# Altium project RK3588底板.PrjPcb (part 1 of 5)
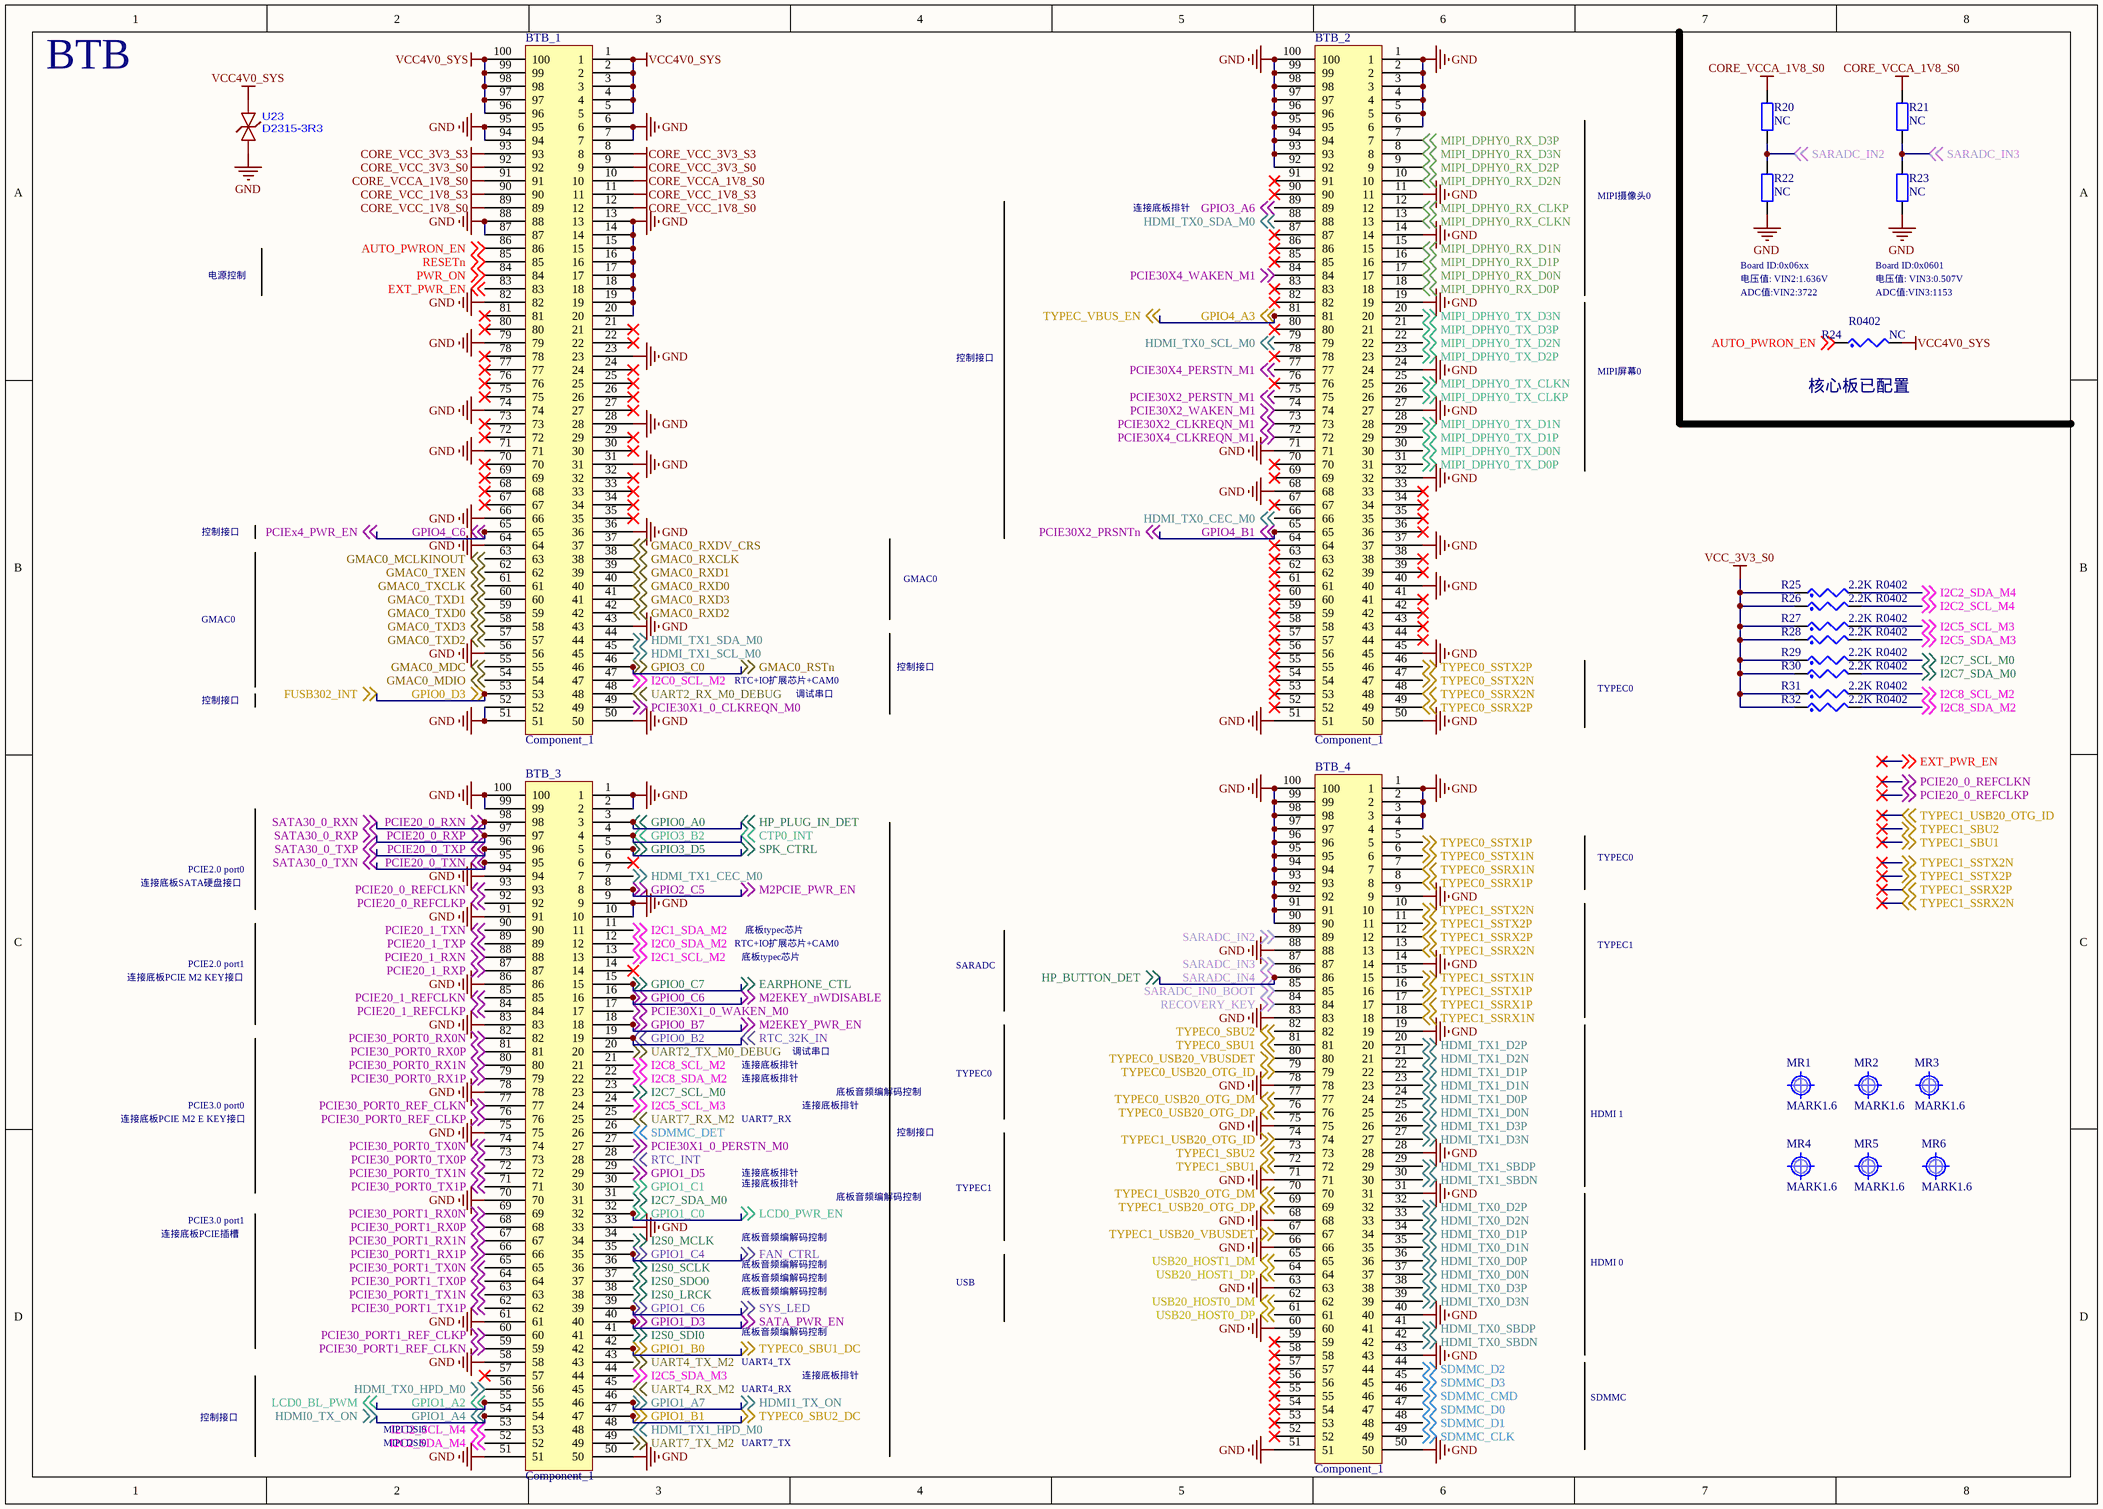
[diagram p0: 1.BTB.SchDoc]
13 sheets, 715 parts. Net scope: global (net labels, ports and power ports of the same name join across sheets).
Board file: 0.PCB1.PcbDoc
Sheets:
  1.BTB.SchDoc
  2.电源.SchDoc
  3.DEBUG_SD卡_RTC_按键.SchDoc
  4.以太网_eth1.SchDoc
  5.USB3.SchDoc
  6.音频_FAN_ADC_LED.SchDoc
  7.HDMI2.SchDoc
  8.HDMI2.SchDoc
  9.PCIE3.SchDoc
  10.PCIE2.SchDoc
  11.MIPI DSI_CSI.SchDoc
  12.SATA接口.SchDoc
  13.GPIO扩展接口.SchDoc

## Sheet 1.BTB.SchDoc
size A3; SheetNumber: 1; SheetTotal: 13

### Parts
BTB_1  Component_1  [F_100PIN]
BTB_2  Component_1  [F_100PIN]
BTB_3  Component_1  [F_100PIN]
BTB_4  Component_1  [F_100PIN]
MR1  MARK1.6  [Mark 1]
MR2  MARK1.6  [Mark 1]
MR3  MARK1.6  [Mark 1]
MR4  MARK1.6  [Mark 1]
MR5  MARK1.6  [Mark 1]
MR6  MARK1.6  [Mark 1]
R20  NC  [R0402_L]
R21  NC  [R0402_L]
R22  NC  [R0402_L]
R23  NC  [R0402_L]
R24  NC  [R0402]
R25  2.2K  [R0402]
R26  2.2K  [R0402]
R27  2.2K  [R0402]
R28  2.2K  [R0402]
R29  2.2K  [R0402]
R30  2.2K  [R0402]
R31  2.2K  [R0402]
R32  2.2K  [R0402]
U23  D2315-3R3  [DFN1006-2L-BI]

### Nets
CORE_VCC_1V8_S0: BTB_1.12 BTB_1.89
CORE_VCC_1V8_S3: BTB_1.11 BTB_1.90
CORE_VCC_3V3_S0: BTB_1.9 BTB_1.92
CORE_VCC_3V3_S3: BTB_1.8 BTB_1.93
CORE_VCCA_1V8_S0: BTB_1.10 BTB_1.91 R20.2 R21.2
GND: BTB_1.6 BTB_1.7 BTB_1.13 BTB_1.14 BTB_1.15 BTB_1.16 BTB_1.17 BTB_1.18 BTB_1.19 BTB_1.20 BTB_1.23 BTB_1.28 BTB_1.31 BTB_1.36 BTB_1.43 BTB_1.50 BTB_1.51 BTB_1.52 BTB_1.56 BTB_1.64 BTB_1.66 BTB_1.71 BTB_1.74 BTB_1.79 BTB_1.82 BTB_1.87 BTB_1.88 BTB_1.94 BTB_1.95 BTB_2.1 BTB_2.2 BTB_2.3 BTB_2.4 BTB_2.5 BTB_2.6 BTB_2.11 BTB_2.14 BTB_2.19 BTB_2.24 BTB_2.27 BTB_2.32 BTB_2.37 BTB_2.40 BTB_2.45 BTB_2.50 BTB_2.51 BTB_2.68 BTB_2.71 BTB_2.92 BTB_2.93 BTB_2.94 BTB_2.95 BTB_2.96 BTB_2.97 BTB_2.98 BTB_2.99 BTB_2.100 BTB_3.1 BTB_3.2 BTB_3.9 BTB_3.10 BTB_3.33 BTB_3.50 BTB_3.51 BTB_3.58 BTB_3.61 BTB_3.70 BTB_3.75 BTB_3.78 BTB_3.83 BTB_3.86 BTB_3.91 BTB_3.94 BTB_3.99 BTB_3.100 BTB_4.1 BTB_4.2 BTB_4.3 BTB_4.4 BTB_4.9 BTB_4.14 BTB_4.19 BTB_4.28 BTB_4.31 BTB_4.40 BTB_4.43 BTB_4.50 BTB_4.51 BTB_4.60 BTB_4.63 BTB_4.66 BTB_4.68 BTB_4.71 BTB_4.75 BTB_4.78 BTB_4.83 BTB_4.88 BTB_4.90 BTB_4.91 BTB_4.92 BTB_4.93 BTB_4.94 BTB_4.95 BTB_4.96 BTB_4.97 BTB_4.98 BTB_4.99 BTB_4.100 R22.1 R23.1 U23.1
VCC4V0_SYS: BTB_1.1 BTB_1.2 BTB_1.3 BTB_1.4 BTB_1.5 BTB_1.96 BTB_1.97 BTB_1.98 BTB_1.99 BTB_1.100 R24.2 U23.2
VCC_3V3_S0: R25.1 R26.1 R27.1 R28.1 R29.1 R30.1 R31.1 R32.1
AUTO_PWRON_EN: BTB_1.86 R24.1 ; off-sheet AUTO_PWRON_EN
CTP0_INT: BTB_3.4 ; off-sheet GPIO3_B2, off-sheet CTP0_INT  [also labelled GPIO3_B2]
EARPHONE_CTL: BTB_3.15 ; off-sheet GPIO0_C7, off-sheet EARPHONE_CTL  [also labelled GPIO0_C7]
EXT_PWR_EN: BTB_1.83 ; off-sheet EXT_PWR_EN
FAN_CTRL: BTB_3.35 ; off-sheet GPIO1_C4, off-sheet FAN_CTRL  [also labelled GPIO1_C4]
FUSB302_INT: BTB_1.53 ; off-sheet GPIO0_D3, off-sheet FUSB302_INT  [also labelled GPIO0_D3]
GMAC0_MCLKINOUT: BTB_1.63 ; off-sheet GMAC0_MCLKINOUT
GMAC0_MDC: BTB_1.55 ; off-sheet GMAC0_MDC
GMAC0_MDIO: BTB_1.54 ; off-sheet GMAC0_MDIO
GMAC0_RSTn: BTB_1.46 ; off-sheet GPIO3_C0, off-sheet GMAC0_RSTn  [also labelled GPIO3_C0]
GMAC0_RXCLK: BTB_1.38 ; off-sheet GMAC0_RXCLK
GMAC0_RXD0: BTB_1.40 ; off-sheet GMAC0_RXD0
GMAC0_RXD1: BTB_1.39 ; off-sheet GMAC0_RXD1
GMAC0_RXD2: BTB_1.42 ; off-sheet GMAC0_RXD2
GMAC0_RXD3: BTB_1.41 ; off-sheet GMAC0_RXD3
GMAC0_RXDV_CRS: BTB_1.37 ; off-sheet GMAC0_RXDV_CRS
GMAC0_TXCLK: BTB_1.61 ; off-sheet GMAC0_TXCLK
GMAC0_TXD0: BTB_1.59 ; off-sheet GMAC0_TXD0
GMAC0_TXD1: BTB_1.60 ; off-sheet GMAC0_TXD1
GMAC0_TXD2: BTB_1.57 ; off-sheet GMAC0_TXD2
GMAC0_TXD3: BTB_1.58 ; off-sheet GMAC0_TXD3
GMAC0_TXEN: BTB_1.62 ; off-sheet GMAC0_TXEN
GPIO0_A0: BTB_3.3 ; off-sheet GPIO0_A0, off-sheet HP_PLUG_IN_DET  [also labelled HP_PLUG_IN_DET]
GPIO0_B2: BTB_3.19 ; off-sheet GPIO0_B2, off-sheet RTC_32K_IN  [also labelled RTC_32K_IN]
GPIO0_B7: BTB_3.18 ; off-sheet GPIO0_B7, off-sheet M2EKEY_PWR_EN  [also labelled M2EKEY_PWR_EN]
GPIO0_C6: BTB_3.16 ; off-sheet GPIO0_C6, off-sheet M2EKEY_nWDISABLE  [also labelled M2EKEY_nWDISABLE]
GPIO1_A2: BTB_3.55 ; off-sheet GPIO1_A2, off-sheet LCD0_BL_PWM  [also labelled LCD0_BL_PWM]
GPIO1_A4: BTB_3.54 ; off-sheet GPIO1_A4, off-sheet HDMI0_TX_ON  [also labelled HDMI0_TX_ON]
GPIO1_A7: BTB_3.46 ; off-sheet GPIO1_A7, off-sheet HDMI1_TX_ON  [also labelled HDMI1_TX_ON]
GPIO1_B0: BTB_3.42 ; off-sheet GPIO1_B0, off-sheet TYPEC0_SBU1_DC  [also labelled TYPEC0_SBU1_DC]
GPIO1_B1: BTB_3.47 ; off-sheet GPIO1_B1, off-sheet TYPEC0_SBU2_DC  [also labelled TYPEC0_SBU2_DC]
GPIO1_C0: BTB_3.32 ; off-sheet GPIO1_C0, off-sheet LCD0_PWR_EN  [also labelled LCD0_PWR_EN]
GPIO1_C1: BTB_3.30 ; off-sheet GPIO1_C1
GPIO1_C6: BTB_3.39 ; off-sheet GPIO1_C6, off-sheet SYS_LED  [also labelled SYS_LED]
GPIO1_D3: BTB_3.40 ; off-sheet GPIO1_D3, off-sheet SATA_PWR_EN  [also labelled SATA_PWR_EN]
GPIO1_D5: BTB_3.29 ; off-sheet GPIO1_D5
GPIO2_C5: BTB_3.8 ; off-sheet GPIO2_C5, off-sheet M2PCIE_PWR_EN  [also labelled M2PCIE_PWR_EN]
GPIO3_A6: BTB_2.89 ; off-sheet GPIO3_A6
GPIO3_D5: BTB_3.5 ; off-sheet GPIO3_D5, off-sheet SPK_CTRL  [also labelled SPK_CTRL]
GPIO4_A3: BTB_2.81 ; off-sheet GPIO4_A3, off-sheet TYPEC_VBUS_EN  [also labelled TYPEC_VBUS_EN]
GPIO4_B1: BTB_2.65 ; off-sheet GPIO4_B1, off-sheet PCIE30X2_PRSNTn  [also labelled PCIE30X2_PRSNTn]
GPIO4_C6: BTB_1.65 ; off-sheet GPIO4_C6, off-sheet PCIEx4_PWR_EN  [also labelled PCIEx4_PWR_EN]
HDMI_TX0_CEC_M0: BTB_2.66 ; off-sheet HDMI_TX0_CEC_M0
HDMI_TX0_D0N: BTB_4.37 ; off-sheet HDMI_TX0_D0N
HDMI_TX0_D0P: BTB_4.36 ; off-sheet HDMI_TX0_D0P
HDMI_TX0_D1N: BTB_4.35 ; off-sheet HDMI_TX0_D1N
HDMI_TX0_D1P: BTB_4.34 ; off-sheet HDMI_TX0_D1P
HDMI_TX0_D2N: BTB_4.33 ; off-sheet HDMI_TX0_D2N
HDMI_TX0_D2P: BTB_4.32 ; off-sheet HDMI_TX0_D2P
HDMI_TX0_D3N: BTB_4.39 ; off-sheet HDMI_TX0_D3N
HDMI_TX0_D3P: BTB_4.38 ; off-sheet HDMI_TX0_D3P
HDMI_TX0_HPD_M0: BTB_3.56 ; off-sheet HDMI_TX0_HPD_M0
HDMI_TX0_SBDN: BTB_4.42 ; off-sheet HDMI_TX0_SBDN
HDMI_TX0_SBDP: BTB_4.41 ; off-sheet HDMI_TX0_SBDP
HDMI_TX0_SCL_M0: BTB_2.79 ; off-sheet HDMI_TX0_SCL_M0
HDMI_TX0_SDA_M0: BTB_2.88 ; off-sheet HDMI_TX0_SDA_M0
HDMI_TX1_CEC_M0: BTB_3.7 ; off-sheet HDMI_TX1_CEC_M0
HDMI_TX1_D0N: BTB_4.25 ; off-sheet HDMI_TX1_D0N
HDMI_TX1_D0P: BTB_4.24 ; off-sheet HDMI_TX1_D0P
HDMI_TX1_D1N: BTB_4.23 ; off-sheet HDMI_TX1_D1N
HDMI_TX1_D1P: BTB_4.22 ; off-sheet HDMI_TX1_D1P
HDMI_TX1_D2N: BTB_4.21 ; off-sheet HDMI_TX1_D2N
HDMI_TX1_D2P: BTB_4.20 ; off-sheet HDMI_TX1_D2P
HDMI_TX1_D3N: BTB_4.27 ; off-sheet HDMI_TX1_D3N
HDMI_TX1_D3P: BTB_4.26 ; off-sheet HDMI_TX1_D3P
HDMI_TX1_HPD_M0: BTB_3.48 ; off-sheet HDMI_TX1_HPD_M0
HDMI_TX1_SBDN: BTB_4.30 ; off-sheet HDMI_TX1_SBDN
HDMI_TX1_SBDP: BTB_4.29 ; off-sheet HDMI_TX1_SBDP
HDMI_TX1_SCL_M0: BTB_1.45 ; off-sheet HDMI_TX1_SCL_M0
HDMI_TX1_SDA_M0: BTB_1.44 ; off-sheet HDMI_TX1_SDA_M0
HP_BUTTON_DET: BTB_4.86 ; off-sheet SARADC_IN4, off-sheet HP_BUTTON_DET  [also labelled SARADC_IN4]
I2C0_SCL_M2: BTB_1.47 ; off-sheet I2C0_SCL_M2
I2C0_SDA_M2: BTB_3.12 ; off-sheet I2C0_SDA_M2
I2C1_SCL_M2: BTB_3.13 ; off-sheet I2C1_SCL_M2
I2C1_SDA_M2: BTB_3.11 ; off-sheet I2C1_SDA_M2
I2C2_SCL_M4: BTB_3.53 R26.2 ; off-sheet I2C2_SCL_M4
I2C2_SDA_M4: BTB_3.52 R25.2 ; off-sheet I2C2_SDA_M4
I2C5_SCL_M3: BTB_3.24 R27.2 ; off-sheet I2C5_SCL_M3
I2C5_SDA_M3: BTB_3.44 R28.2 ; off-sheet I2C5_SDA_M3
I2C7_SCL_M0: BTB_3.23 R29.2 ; off-sheet I2C7_SCL_M0
I2C7_SDA_M0: BTB_3.31 R30.2 ; off-sheet I2C7_SDA_M0
I2C8_SCL_M2: BTB_3.21 R31.2 ; off-sheet I2C8_SCL_M2
I2C8_SDA_M2: BTB_3.22 R32.2 ; off-sheet I2C8_SDA_M2
I2S0_LRCK: BTB_3.38 ; off-sheet I2S0_LRCK
I2S0_MCLK: BTB_3.34 ; off-sheet I2S0_MCLK
I2S0_SCLK: BTB_3.36 ; off-sheet I2S0_SCLK
I2S0_SDI0: BTB_3.41 ; off-sheet I2S0_SDI0
I2S0_SDO0: BTB_3.37 ; off-sheet I2S0_SDO0
MIPI_DPHY0_RX_CLKN: BTB_2.13 ; off-sheet MIPI_DPHY0_RX_CLKN
MIPI_DPHY0_RX_CLKP: BTB_2.12 ; off-sheet MIPI_DPHY0_RX_CLKP
MIPI_DPHY0_RX_D0N: BTB_2.17 ; off-sheet MIPI_DPHY0_RX_D0N
MIPI_DPHY0_RX_D0P: BTB_2.18 ; off-sheet MIPI_DPHY0_RX_D0P
MIPI_DPHY0_RX_D1N: BTB_2.15 ; off-sheet MIPI_DPHY0_RX_D1N
MIPI_DPHY0_RX_D1P: BTB_2.16 ; off-sheet MIPI_DPHY0_RX_D1P
MIPI_DPHY0_RX_D2N: BTB_2.10 ; off-sheet MIPI_DPHY0_RX_D2N
MIPI_DPHY0_RX_D2P: BTB_2.9 ; off-sheet MIPI_DPHY0_RX_D2P
MIPI_DPHY0_RX_D3N: BTB_2.8 ; off-sheet MIPI_DPHY0_RX_D3N
MIPI_DPHY0_RX_D3P: BTB_2.7 ; off-sheet MIPI_DPHY0_RX_D3P
MIPI_DPHY0_TX_CLKN: BTB_2.25 ; off-sheet MIPI_DPHY0_TX_CLKN
MIPI_DPHY0_TX_CLKP: BTB_2.26 ; off-sheet MIPI_DPHY0_TX_CLKP
MIPI_DPHY0_TX_D0N: BTB_2.30 ; off-sheet MIPI_DPHY0_TX_D0N
MIPI_DPHY0_TX_D0P: BTB_2.31 ; off-sheet MIPI_DPHY0_TX_D0P
MIPI_DPHY0_TX_D1N: BTB_2.28 ; off-sheet MIPI_DPHY0_TX_D1N
MIPI_DPHY0_TX_D1P: BTB_2.29 ; off-sheet MIPI_DPHY0_TX_D1P
MIPI_DPHY0_TX_D2N: BTB_2.22 ; off-sheet MIPI_DPHY0_TX_D2N
MIPI_DPHY0_TX_D2P: BTB_2.23 ; off-sheet MIPI_DPHY0_TX_D2P
MIPI_DPHY0_TX_D3N: BTB_2.20 ; off-sheet MIPI_DPHY0_TX_D3N
MIPI_DPHY0_TX_D3P: BTB_2.21 ; off-sheet MIPI_DPHY0_TX_D3P
PCIE20_0_REFCLKN: BTB_3.93 ; off-sheet PCIE20_0_REFCLKN
PCIE20_0_REFCLKP: BTB_3.92 ; off-sheet PCIE20_0_REFCLKP
PCIE20_0_RXN: BTB_3.98 ; off-sheet PCIE20_0_RXN, off-sheet SATA30_0_RXN  [also labelled SATA30_0_RXN]
PCIE20_0_RXP: BTB_3.97 ; off-sheet PCIE20_0_RXP, off-sheet SATA30_0_RXP  [also labelled SATA30_0_RXP]
PCIE20_0_TXN: BTB_3.95 ; off-sheet PCIE20_0_TXN, off-sheet SATA30_0_TXN  [also labelled SATA30_0_TXN]
PCIE20_0_TXP: BTB_3.96 ; off-sheet PCIE20_0_TXP, off-sheet SATA30_0_TXP  [also labelled SATA30_0_TXP]
PCIE20_1_REFCLKN: BTB_3.85 ; off-sheet PCIE20_1_REFCLKN
PCIE20_1_REFCLKP: BTB_3.84 ; off-sheet PCIE20_1_REFCLKP
PCIE20_1_RXN: BTB_3.88 ; off-sheet PCIE20_1_RXN
PCIE20_1_RXP: BTB_3.87 ; off-sheet PCIE20_1_RXP
PCIE20_1_TXN: BTB_3.90 ; off-sheet PCIE20_1_TXN
PCIE20_1_TXP: BTB_3.89 ; off-sheet PCIE20_1_TXP
PCIE30_PORT0_REF_CLKN: BTB_3.77 ; off-sheet PCIE30_PORT0_REF_CLKN
PCIE30_PORT0_REF_CLKP: BTB_3.76 ; off-sheet PCIE30_PORT0_REF_CLKP
PCIE30_PORT0_RX0N: BTB_3.82 ; off-sheet PCIE30_PORT0_RX0N
PCIE30_PORT0_RX0P: BTB_3.81 ; off-sheet PCIE30_PORT0_RX0P
PCIE30_PORT0_RX1N: BTB_3.80 ; off-sheet PCIE30_PORT0_RX1N
PCIE30_PORT0_RX1P: BTB_3.79 ; off-sheet PCIE30_PORT0_RX1P
PCIE30_PORT0_TX0N: BTB_3.74 ; off-sheet PCIE30_PORT0_TX0N
PCIE30_PORT0_TX0P: BTB_3.73 ; off-sheet PCIE30_PORT0_TX0P
PCIE30_PORT0_TX1N: BTB_3.72 ; off-sheet PCIE30_PORT0_TX1N
PCIE30_PORT0_TX1P: BTB_3.71 ; off-sheet PCIE30_PORT0_TX1P
PCIE30_PORT1_REF_CLKN: BTB_3.59 ; off-sheet PCIE30_PORT1_REF_CLKN
PCIE30_PORT1_REF_CLKP: BTB_3.60 ; off-sheet PCIE30_PORT1_REF_CLKP
PCIE30_PORT1_RX0N: BTB_3.69 ; off-sheet PCIE30_PORT1_RX0N
PCIE30_PORT1_RX0P: BTB_3.68 ; off-sheet PCIE30_PORT1_RX0P
PCIE30_PORT1_RX1N: BTB_3.67 ; off-sheet PCIE30_PORT1_RX1N
PCIE30_PORT1_RX1P: BTB_3.66 ; off-sheet PCIE30_PORT1_RX1P
PCIE30_PORT1_TX0N: BTB_3.65 ; off-sheet PCIE30_PORT1_TX0N
PCIE30_PORT1_TX0P: BTB_3.64 ; off-sheet PCIE30_PORT1_TX0P
PCIE30_PORT1_TX1N: BTB_3.63 ; off-sheet PCIE30_PORT1_TX1N
PCIE30_PORT1_TX1P: BTB_3.62 ; off-sheet PCIE30_PORT1_TX1P
PCIE30X1_0_CLKREQN_M0: BTB_1.49 ; off-sheet PCIE30X1_0_CLKREQN_M0
PCIE30X1_0_PERSTN_M0: BTB_3.27 ; off-sheet PCIE30X1_0_PERSTN_M0
PCIE30X1_0_WAKEN_M0: BTB_3.17 ; off-sheet PCIE30X1_0_WAKEN_M0
PCIE30X2_CLKREQN_M1: BTB_2.73 ; off-sheet PCIE30X2_CLKREQN_M1
PCIE30X2_PERSTN_M1: BTB_2.75 ; off-sheet PCIE30X2_PERSTN_M1
PCIE30X2_WAKEN_M1: BTB_2.74 ; off-sheet PCIE30X2_WAKEN_M1
PCIE30X4_CLKREQN_M1: BTB_2.72 ; off-sheet PCIE30X4_CLKREQN_M1
PCIE30X4_PERSTN_M1: BTB_2.77 ; off-sheet PCIE30X4_PERSTN_M1
PCIE30X4_WAKEN_M1: BTB_2.84 ; off-sheet PCIE30X4_WAKEN_M1
PWR_ON: BTB_1.84 ; off-sheet PWR_ON
RECOVERY_KEY: BTB_4.84 ; off-sheet RECOVERY_KEY
RESETn: BTB_1.85 ; off-sheet RESETn
RTC_INT: BTB_3.28 ; off-sheet RTC_INT
SARADC_IN0_BOOT: BTB_4.85 ; off-sheet SARADC_IN0_BOOT
SARADC_IN2: BTB_4.89 R20.1 R22.2 ; off-sheet SARADC_IN2
SARADC_IN3: BTB_4.87 R21.1 R23.2 ; off-sheet SARADC_IN3
SDMMC_CLK: BTB_4.49 ; off-sheet SDMMC_CLK
SDMMC_CMD: BTB_4.46 ; off-sheet SDMMC_CMD
SDMMC_D0: BTB_4.47 ; off-sheet SDMMC_D0
SDMMC_D1: BTB_4.48 ; off-sheet SDMMC_D1
SDMMC_D2: BTB_4.44 ; off-sheet SDMMC_D2
SDMMC_D3: BTB_4.45 ; off-sheet SDMMC_D3
SDMMC_DET: BTB_3.26 ; off-sheet SDMMC_DET
TYPEC0_SBU1: BTB_4.81 ; off-sheet TYPEC0_SBU1
TYPEC0_SBU2: BTB_4.82 ; off-sheet TYPEC0_SBU2
TYPEC0_SSRX1N: BTB_4.7 ; off-sheet TYPEC0_SSRX1N
TYPEC0_SSRX1P: BTB_4.8 ; off-sheet TYPEC0_SSRX1P
TYPEC0_SSRX2N: BTB_2.48 ; off-sheet TYPEC0_SSRX2N
TYPEC0_SSRX2P: BTB_2.49 ; off-sheet TYPEC0_SSRX2P
TYPEC0_SSTX1N: BTB_4.6 ; off-sheet TYPEC0_SSTX1N
TYPEC0_SSTX1P: BTB_4.5 ; off-sheet TYPEC0_SSTX1P
TYPEC0_SSTX2N: BTB_2.47 ; off-sheet TYPEC0_SSTX2N
TYPEC0_SSTX2P: BTB_2.46 ; off-sheet TYPEC0_SSTX2P
TYPEC0_USB20_OTG_DM: BTB_4.77 ; off-sheet TYPEC0_USB20_OTG_DM
TYPEC0_USB20_OTG_DP: BTB_4.76 ; off-sheet TYPEC0_USB20_OTG_DP
TYPEC0_USB20_OTG_ID: BTB_4.79 ; off-sheet TYPEC0_USB20_OTG_ID
TYPEC0_USB20_VBUSDET: BTB_4.80 ; off-sheet TYPEC0_USB20_VBUSDET
TYPEC1_SBU1: BTB_4.72 ; off-sheet TYPEC1_SBU1
TYPEC1_SBU2: BTB_4.73 ; off-sheet TYPEC1_SBU2
TYPEC1_SSRX1N: BTB_4.18 ; off-sheet TYPEC1_SSRX1N
TYPEC1_SSRX1P: BTB_4.17 ; off-sheet TYPEC1_SSRX1P
TYPEC1_SSRX2N: BTB_4.13 ; off-sheet TYPEC1_SSRX2N
TYPEC1_SSRX2P: BTB_4.12 ; off-sheet TYPEC1_SSRX2P
TYPEC1_SSTX1N: BTB_4.15 ; off-sheet TYPEC1_SSTX1N
TYPEC1_SSTX1P: BTB_4.16 ; off-sheet TYPEC1_SSTX1P
TYPEC1_SSTX2N: BTB_4.10 ; off-sheet TYPEC1_SSTX2N
TYPEC1_SSTX2P: BTB_4.11 ; off-sheet TYPEC1_SSTX2P
TYPEC1_USB20_OTG_DM: BTB_4.70 ; off-sheet TYPEC1_USB20_OTG_DM
TYPEC1_USB20_OTG_DP: BTB_4.69 ; off-sheet TYPEC1_USB20_OTG_DP
TYPEC1_USB20_OTG_ID: BTB_4.74 ; off-sheet TYPEC1_USB20_OTG_ID
TYPEC1_USB20_VBUSDET: BTB_4.67 ; off-sheet TYPEC1_USB20_VBUSDET
UART2_RX_M0_DEBUG: BTB_1.48 ; off-sheet UART2_RX_M0_DEBUG
UART2_TX_M0_DEBUG: BTB_3.20 ; off-sheet UART2_TX_M0_DEBUG
UART4_RX_M2: BTB_3.45 ; off-sheet UART4_RX_M2
UART4_TX_M2: BTB_3.43 ; off-sheet UART4_TX_M2
UART7_RX_M2: BTB_3.25 ; off-sheet UART7_RX_M2
UART7_TX_M2: BTB_3.49 ; off-sheet UART7_TX_M2
USB20_HOST0_DM: BTB_4.62 ; off-sheet USB20_HOST0_DM
USB20_HOST0_DP: BTB_4.61 ; off-sheet USB20_HOST0_DP
USB20_HOST1_DM: BTB_4.65 ; off-sheet USB20_HOST1_DM
USB20_HOST1_DP: BTB_4.64 ; off-sheet USB20_HOST1_DP

Not connected (* = marked no-connect by the designer): BTB_1 21* 22* 24* 25* 26* 27* 29* 30* 32* 33* 34* 35* 67* 68* 69* 70* 72* 73* 75* 76* 77* 78* 80* 81*; BTB_2 33* 34* 35* 36* 38* 39* 41* 42* 43* 44* 52* 53* 54* 55* 56* 57* 58* 59* 60* 61* 62* 63* 64* 67* 69* 70* 76* 78* 80* 82* 83* 85* 86* 87* 90* 91*; BTB_3 6* 14* 57*; BTB_4 52* 53* 54* 55* 56* 57* 58* 59*

### Notes on the sheet
- BTB
- 连接底板排针
- MIPI摄像头0
- 电源控制
- Board ID:0x06xx
- 电压值: VIN2:1.636V
- ADC值:VIN2:3722
- Board ID:0x0601
- 电压值: VIN3:0.507V
- (near R24) ADC值:VIN3:1153
- 控制接口
- MIPI屏幕0
- (near R24) 核心板已配置
- GMAC0
- RTC+IO扩展芯片+CAM0
- 调试串口
- TYPEC0
- 连接底板SATA硬盘接口
- PCIE2.0 port0
- 连接底板PCIE M2 KEY接口
- PCIE2.0 port1
- 底板typec芯片
- SARADC
- TYPEC1
- 连接底板PCIE M2 E KEY接口
- PCIE3.0 port0
- UART7_RX
- 底板音频编解码控制
- HDMI 1
- 连接底板PCIE插槽
- PCIE3.0 port1
- USB
- HDMI 0
- UART4_RX
- UART4_TX
- MIPI DSI0
- UART7_TX
- SDMMC

### Library data of the parts
MR1-MR6 = MARK: 光学定位点; 联系下单店铺卖家 免费技术支持: 联系下单店铺卖家 免费帮你查找封装; BOM名称: 光学定位点
R20-R23 = R: 贴片电阻; 联系下单店铺卖家 免费帮你查找封装: 联系下单店铺卖家 免费技术支持; BOM名称: 贴片电阻
R24 = RES: CLASS: DISCRETE; 规格: 贴片电阻1K 1% 1/16W 0402; 规格编号: RI0402L1001FT; 条码: EBF29070050; 品牌: 合科泰; 类别: 贴片电阻0402; 规格书: 合科泰-RI系列电阻.pdf; 生命周期: 量产; PCB Footprint: R0402
R25-R32 = RES: CLASS: DISCRETE; 类别: 贴片电阻0402; 条码: EBF29070087; 规格: 贴片电阻NC 预留; PCB Footprint: R0402

## Sheet 2.电源.SchDoc
size 297 x 209 mm; SheetNumber: 2; SheetTotal: 13
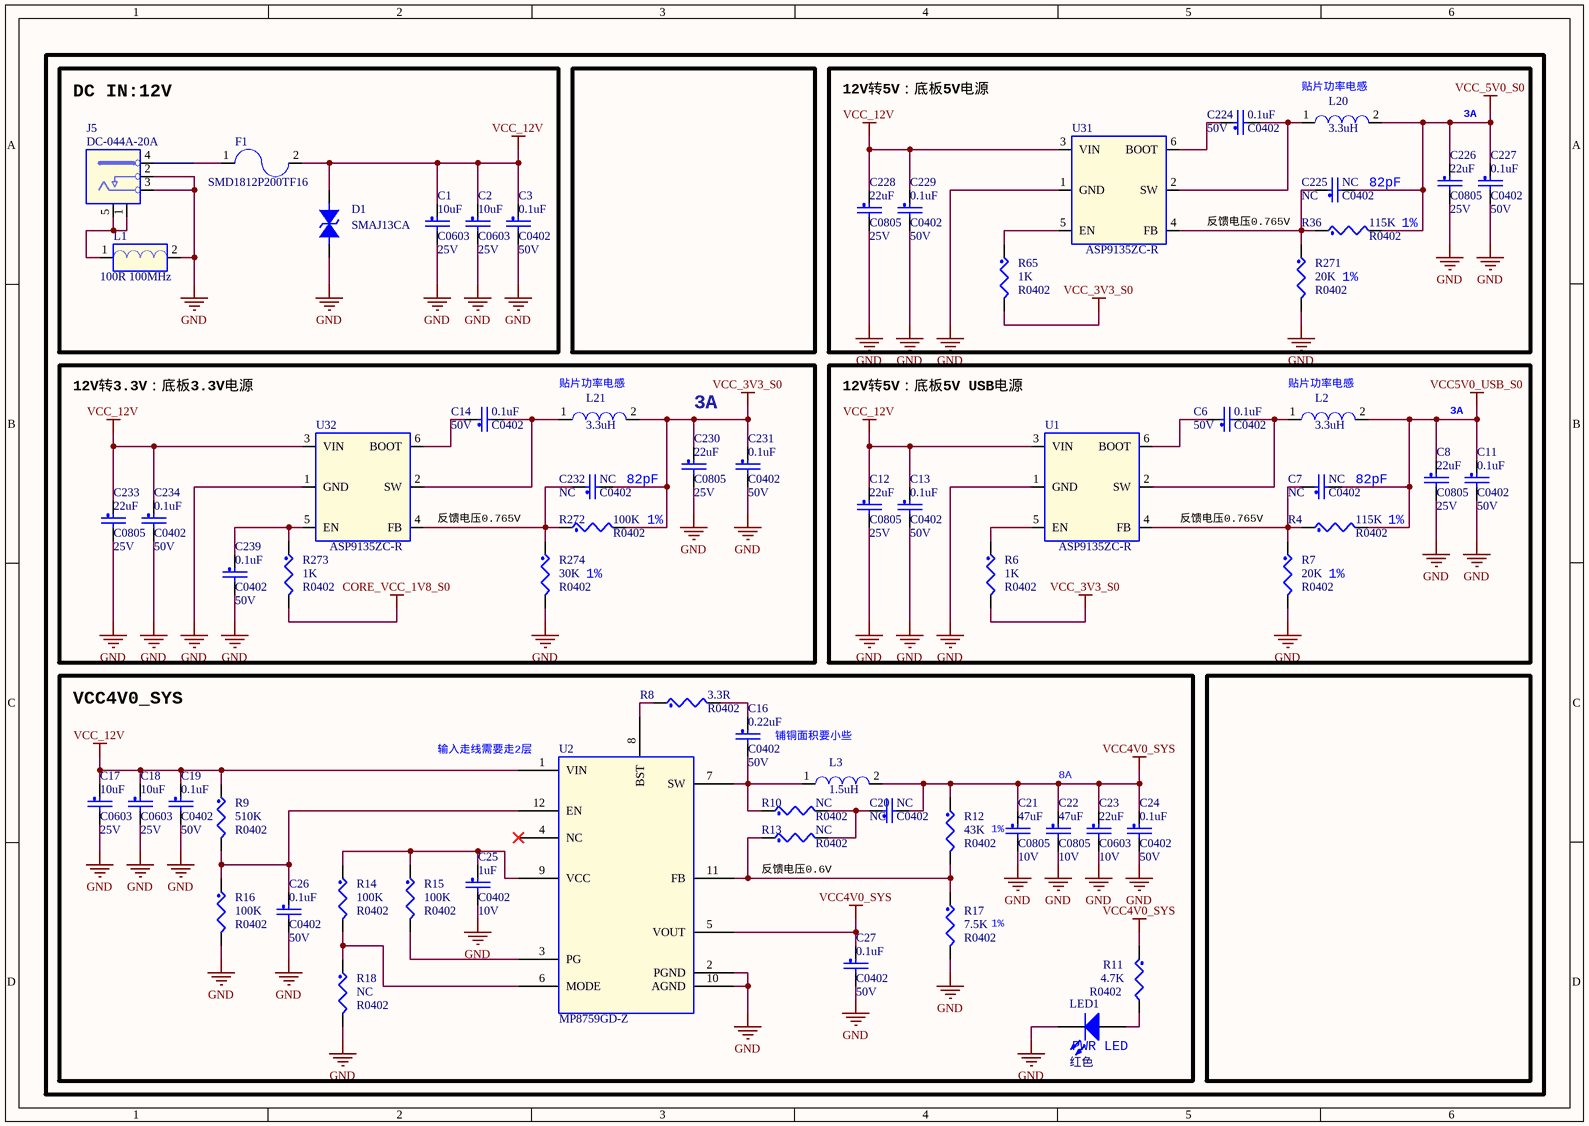
[diagram p1: 2.电源.SchDoc]

### Parts
C1  10uF  Voltage: 25V  [C0603]
C2  10uF  Voltage: 25V  [C0603]
C3  0.1uF  Voltage: 50V  [C0402]
C6  0.1uF  Voltage: 50V  [C0402]
C7  NC  [C0402]
C8  22uF  Voltage: 25V  [C0805]
C11  0.1uF  Voltage: 50V  [C0402]
C12  22uF  Voltage: 25V  [C0805]
C13  0.1uF  Voltage: 50V  [C0402]
C14  0.1uF  Voltage: 50V  [C0402]
C16  0.22uF  Voltage: 50V  [C0402]
C17  10uF  Voltage: 25V  [C0603]
C18  10uF  Voltage: 25V  [C0603]
C19  0.1uF  Voltage: 50V  [C0402]
C20  NC  [C0402]
C21  47uF  Voltage: 10V  [C0805]
C22  47uF  Voltage: 10V  [C0805]
C23  22uF  Voltage: 10V  [C0603]
C24  0.1uF  Voltage: 50V  [C0402]
C25  1uF  Voltage: 10V  [C0402]
C26  0.1uF  Voltage: 50V  [C0402]
C27  0.1uF  Voltage: 50V  [C0402]
C224  0.1uF  Voltage: 50V  [C0402]
C225  NC  [C0402]
C226  22uF  Voltage: 25V  [C0805]
C227  0.1uF  Voltage: 50V  [C0402]
C228  22uF  Voltage: 25V  [C0805]
C229  0.1uF  Voltage: 50V  [C0402]
C230  22uF  Voltage: 25V  [C0805]
C231  0.1uF  Voltage: 50V  [C0402]
C232  NC  [C0402]
C233  22uF  Voltage: 25V  [C0805]
C234  0.1uF  Voltage: 50V  [C0402]
C239  0.1uF  Voltage: 50V  [C0402]
D1  SMAJ13CA  [SMA_CA]
F1  SMD1812P200TF16  [F1812]
J5  DC-044A-20A  [dc_in_th_3p_10r1x11r6]
L1  100R 100MHz  [L0603]
L2  3.3uH  [l4520]
L3  1.5uH  [L0518]
L20  3.3uH  [l4520]
L21  3.3uH  [l4520]
LED1  红色  [LED0603_R]
R4  115K  [R0402]
R6  1K  [R0402]
R7  20K  [R0402]
R8  3.3R  [R0402]
R9  510K  [R0402]
R10  NC  [R0402]
R11  4.7K  [R0402]
R12  43K  [R0402]
R13  NC  [R0402]
R14  100K  [R0402]
R15  100K  [R0402]
R16  100K  [R0402]
R17  7.5K  [R0402]
R18  NC  [R0402]
R36  115K  [R0402]
R65  1K  [R0402]
R271  20K  [R0402]
R272  100K  [R0402]
R273  1K  [R0402]
R274  30K  [R0402]
U1  ASP9135ZC-R  [SOT23_6]
U2  MP8759GD-Z  [QFN12-2R00X3R00]
U31  ASP9135ZC-R  [SOT23_6]
U32  ASP9135ZC-R  [SOT23_6]

### Blocks framed on the sheet
DC IN:12V: C1-C3 D1 F1 J5 L1
12V转5V：底板5V电源: C224-C229 L20 R36 R65 R271 U31
3A: C14 C230-C234 C239 L21 R272-R274 U32
12V转5V：底板5V USB电源: C6-C8 C11-C13 L2 R4 R6 R7 U1
VCC4V0_SYS: C16-C27 L3 LED1 R8-R18 U2

### Nets
CORE_VCC_1V8_S0: R273.2
GND: C1.2 C2.2 C3.2 C8.2 C11.2 C12.2 C13.2 C17.2 C18.2 C19.2 C21.2 C22.2 C23.2 C24.2 C25.2 C26.2 C27.2 C226.2 C227.2 C228.2 C229.2 C230.2 C231.2 C233.2 C234.2 C239.2 D1.1 J5.2 J5.3 L1.2 LED1.2(K) R7.2 R16.2 R17.2 R18.2 R271.2 R274.2 U1.1(GND) U2.2(PGND) U2.10(AGND) U31.1(GND) U32.1(GND)
VCC4V0_SYS: C20.2 C21.1 C22.1 C23.1 C24.1 C27.1 L3.2 R11.1 R12.1 U2.5(VOUT)
VCC5V0_USB_S0: C7.2 C8.1 C11.1 L2.2 R4.2
VCC_3V3_S0: C230.1 C231.1 C232.2 L21.2 R6.2 R65.2 R272.2
VCC_5V0_S0: C225.2 C226.1 C227.1 L20.2 R36.2
VCC_12V: C1.1 C2.1 C3.1 C12.1 C13.1 C17.1 C18.1 C19.1 C228.1 C229.1 C233.1 C234.1 D1.2 F1.2 R9.1 U1.3(VIN) U2.1(VIN) U31.3(VIN) U32.3(VIN)
NetC6_1: C6.1 U1.6(BOOT)
NetC6_2: C6.2 L2.1 U1.2(SW)
NetC7_1: C7.1 R4.1 R7.1 U1.4(FB)
NetC14_1: C14.1 U32.6(BOOT)
NetC14_2: C14.2 L21.1 U32.2(SW)
NetC16_1: C16.1 R8.2
NetC16_2: C16.2 L3.1 R10.1 U2.7(SW)
NetC20_1: C20.1 R10.2 R13.2
NetC25_1: C25.1 R14.1 R15.1 U2.9(VCC)
NetC26_1: C26.1 R9.2 R16.1 U2.12(EN)
NetC224_1: C224.1 U31.6(BOOT)
NetC224_2: C224.2 L20.1 U31.2(SW)
NetC225_1: C225.1 R36.1 R271.1 U31.4(FB)
NetC232_1: C232.1 R272.1 R274.1 U32.4(FB)
NetC239_1: C239.1 R273.1 U32.5(EN)
NetF1_1: F1.1 J5.4
NetJ5_1: J5.1 J5.5 L1.1
NetLED1_1: LED1.1(A) R11.2
NetR6_1: R6.1 U1.5(EN)
NetR8_1: R8.1 U2.8(BST)
NetR12_2: R12.2 R13.1 R17.1 U2.11(FB)
NetR14_2: R14.2 R18.1 U2.6(MODE)
NetR15_2: R15.2 U2.3(PG)
NetR65_1: R65.1 U31.5(EN)

Not connected (* = marked no-connect by the designer): U2 4(NC)*

### Notes on the sheet
- (near L20) 贴片功率电感
- 3A
- 82pF
- 反馈电压0.765V
- 1%
- 12V转3.3V：底板3.3V电源
- (near L21) 贴片功率电感
- (near L2) 贴片功率电感
- (near U32) 反馈电压0.765V
- 铺铜面积要小些
- 输入走线需要走2层
- 8A
- (near R13) 反馈电压0.6V
- (near C21) 1%
- (near R17) 1%
- (near LED1) PWR LED

### Library data of the parts
C1 C2 C17 C18 = CAP_NP: CLASS: DISCRETE; 生命周期: 量产; 价格: 0.109811; 规格书: 三星电容.pdf; 类别: 贴片电容0603; 品牌: 三星; 条码: EBF29060171; 规格编号: CL10A106MA8NRNC; 规格: 贴片电容10uF 20% 25V X5R 0603; PCB Footprint: C0603
C3 C24 C27 C229 = CAP_NP: CLASS: DISCRETE; 规格: 贴片电容0.1uF 10% 50V X5R 0402; 规格编号: 0402X104K500NT; 条码: EBF29060118; 品牌: 风华; 类别: 贴片电容0402; 规格书: 风华电容.pdf; 价格: 0.029826; 生命周期: 量产; PCB Footprint: C0402
C6 C11 C13 C14 C19 C26 C224 C227 C231 C234 C239 = CAP_NP: CLASS: DISCRETE; 生命周期: 量产; 价格: 0.029826; 规格书: 风华电容.pdf; 类别: 贴片电容0402; 品牌: 风华; 条码: EBF29060118; 规格编号: 0402X104K500NT; 规格: 贴片电容0.1uF 10% 50V X5R 0402; PCB Footprint: C0402
C7 C20 C225 C232 = CAP_NP: CLASS: DISCRETE; 规格: 贴片电容NC 预留; 条码: EBF29060149; 类别: 贴片电容0402; Voltage: NC; PCB Footprint: C0402
C8 C12 C226 C230 C233 = CAP_NP: CLASS: DISCRETE; 规格: 贴片电容22uF 20% 25V X5R 0805; 规格编号: 0805X226M250NT; 条码: EBF29060173; 品牌: 风华; 类别: 贴片电容0805; 规格书: 风华电容.pdf; 价格: 0.285631; 生命周期: 量产; PCB Footprint: C0805
C16 = CAP_NP: CLASS: DISCRETE; 生命周期: 量产; 价格: 0.074942; 规格书: 太诱-贴片电容.pdf; 类别: 贴片电容0402; 品牌: 太诱; 条码: EBF29060266; 规格编号: UMK105BJ224MV-F; 规格: 贴片电容0.22uF 20% 50V X5R 0402; PCB Footprint: C0402
C21 = CAP_NP: CLASS: DISCRETE; 规格: 贴片电容47uF 20% 10V X5R 0805; 规格编号: 0805X476M100NT; 条码: EBF29060212; 品牌: 风华; 类别: 贴片电容0805; 规格书: 风华电容.pdf; 价格: 0.368494; 生命周期: 量产; PCB Footprint: C0805
C22 = CAP_NP: CLASS: DISCRETE; 生命周期: 量产; 价格: 0.368494; 规格书: 风华电容.pdf; 类别: 贴片电容0805; 品牌: 风华; 条码: EBF29060212; 规格编号: 0805X476M100NT; 规格: 贴片电容47uF 20% 10V X5R 0805; PCB Footprint: C0805
C23 = CAP_NP: CLASS: DISCRETE; 生命周期: 量产; 价格: 0.078818; 规格书: 三星电容.pdf; 类别: 贴片电容0603; 品牌: 三星; 条码: EBF29060163; 规格编号: CL10A226MP8NUNE; 规格: 贴片电容22uF 20% 10V X5R 0603; PCB Footprint: C0603
C25 = CAP_NP: CLASS: DISCRETE; 规格: 贴片电容1uF 10% 10V X5R 0402; 规格编号: 0402X105K100NT; 条码: EBF29060121; 品牌: 风华; 类别: 贴片电容0402; 规格书: 风华电容.pdf; 价格: 0.01191; 生命周期: 量产; PCB Footprint: C0402
C228 = CAP_NP: CLASS: DISCRETE; 生命周期: 量产; 价格: 0.285631; 规格书: 风华电容.pdf; 类别: 贴片电容0805; 品牌: 风华; 条码: EBF29060173; 规格编号: 0805X226M250NT; 规格: 贴片电容22uF 20% 25V X5R 0805; PCB Footprint: C0805
D1 = DIODE BI-DIR TRIG: 规格: TVS二极管 箝位电压21.5V 击穿电压14.4V 反向关断电压13V; 条码: EBF29140049; 品牌: 伯恩半导体; 类别: 贴片TVS; 规格书: 伯恩半导体-SMAJ13CA.pdf; 价格: 0.181964; 生命周期: 量产; 规格编号: SMAJ13CA; PCB Footprint: SMA_CA
F1 = FUSE: 规格: 自恢复保险丝 最大电压46V 最大电流100A 保持电流2A 跳闸电流4A; 条码: EBF29270006; 品牌: 瑞隆源; 类别: 自恢复保险丝; 规格书: 瑞隆源-自恢复保险丝.pdf; 价格: 0.385618; 生命周期: 量产; 规格编号: SMD1812P200TF16; PCB Footprint: F1812
J5 = DC-044A-20A: 生命周期: 量产; 规格书: DC插座_内径_2MM外径_5.9MM.pdf; 类别: DC电源座; 条码: EBF29040093; 规格编号: DC-044A-20A DC; 规格: DC-044A-20A DC插座; PCB Footprint: dc_in_th_3p_10r1x11r6
L1 = BEAD: CLASS: DISCRETE; 规格: 磁珠100Ω @100MHz 额定电流3A 直流电阻30mΩ; 规格编号: UPZ1608E101-3R0TF; 条码: EBF29050038; 品牌: 顺络; 类别: 贴片磁珠0603; 规格书: 顺络-磁珠.pdf; 价格: 0.021567; 生命周期: 量产; PCB Footprint: L0603
L2 = IND: CLASS: DISCRETE; 价格: 1.5992; 规格编号: TMPC0402HP-3R3MG-Z02; 规格: 贴片电感3.3uH ±20% 3A 直流电阻69mΩ; 条码: EBF29050040; 品牌: 台庆; 类别: 贴片电感0402; 规格书: 台庆-功率电感.pdf; 生命周期: 量产; PCB Footprint: l4520
L3 = IND: CLASS: DISCRETE; 生命周期: 量产; 价格: 0.525895; 规格书: 长江微电_FXL0518-1R5-M.pdf; 类别: 贴片电感SMD; 品牌: 长江微电; 条码: EBFCIS221116170516; 规格编号: FXL0518-1R5-M; 规格: 贴片电感1.5uH ±20% 7.5A 直流电阻25mΩ; PCB Footprint: L0518
L20 = IND: CLASS: DISCRETE; 价格: 1.5992; 规格编号: TMPC0402HP-3R3MG-Z02; 生命周期: 量产; 规格书: 台庆-功率电感.pdf; 类别: 贴片电感0402; 品牌: 台庆; 条码: EBF29050040; 规格: 贴片电感3.3uH ±20% 3A 直流电阻69mΩ; PCB Footprint: l4520
L21 = IND: CLASS: DISCRETE; 规格: 贴片电感3.3uH ±20% 3A 直流电阻69mΩ; 条码: EBF29050040; 品牌: 台庆; 类别: 贴片电感0402; 规格书: 台庆-功率电感.pdf; 生命周期: 量产; 规格编号: TMPC0402HP-3R3MG-Z02; 价格: 1.5992; PCB Footprint: l4520
LED1 = LED: 贴片LED; 封装库来自淘宝卖家：黄晶宝石: 其他店铺购入均为盗版封装库，无更新权益，请立即申请退款，本店现金奖励200~1000元; BOM名称: 贴片LED
R4 R36 = RES: CLASS: DISCRETE; 生命周期: 量产; 价格: 0.006087; 规格书: YAGEO国巨厚膜无铅电阻.pdf; 类别: 贴片电阻0402; 品牌: 国巨; 条码: EBF29070290; 规格编号: AC0402FR-07115KL; 规格: 贴片电阻115K 1% 1/16W 0402; PCB Footprint: R0402
R6 = RES: as R24 on sheet 1.BTB; PCB Footprint: R0402
R7 R271 = RES: CLASS: DISCRETE; 生命周期: 量产; 价格: 0.002473; 规格书: 厚声-无铅厚膜电阻.pdf; 类别: 贴片电阻0402; 品牌: 厚声; 条码: EBF29070223; 规格编号: 0402WGF2002TCE; 规格: 贴片电阻20K 1% 1/16W 0402; PCB Footprint: R0402
R8 = RES: CLASS: DISCRETE; 规格: 贴片电阻3.3R 1% 1/16W 0402; 规格编号: 0402WGF330KTCE; 条码: EBFCIS221116113428; 品牌: 厚声; 类别: 贴片电阻0402; 规格书: 厚声-无铅厚膜电阻.pdf; 价格: 0.003117; 生命周期: 量产; PCB Footprint: R0402
R9 = RES: CLASS: DISCRETE; 规格: 贴片电阻510K 1% 1/16W 0402; 规格编号: RI0603L5103FT; 条码: EBF29070241; 品牌: 合科泰; 类别: 贴片电阻0402; 规格书: 合科泰-RI系列电阻.pdf; 生命周期: 量产; PCB Footprint: R0402
R10 R13 = RES: as R25 on sheet 1.BTB; PCB Footprint: R0402
R11 = RES: CLASS: DISCRETE; 规格: 贴片电阻4.7K 1% 1/16W 0402; 规格编号: RI0402L4701FT; 条码: EBF29070047; 品牌: 合科泰; 类别: 贴片电阻0402; 规格书: 合科泰-RI系列电阻.pdf; 生命周期: 量产; PCB Footprint: R0402
R12 = RES: CLASS: DISCRETE; 规格: 贴片电阻43K 1% 1/16W 0402; 规格编号: AC0402FR-0743KL; 条码: EBF29070011; 品牌: 国巨; 类别: 贴片电阻0402; 规格书: YAGEO国巨厚膜无铅电阻.pdf; 价格: 0.00683; 生命周期: 量产; PCB Footprint: R0402
R14 = RES: CLASS: DISCRETE; 生命周期: 量产; 规格书: 合科泰-RI系列电阻.pdf; 类别: 贴片电阻0402; 品牌: 合科泰; 条码: EBF29070054; 规格编号: RI0402L1003FT; 规格: 贴片电阻100K 1% 1/16W 0402; PCB Footprint: R0402
R15 R16 R272 = RES: CLASS: DISCRETE; 规格: 贴片电阻100K 1% 1/16W 0402; 规格编号: RI0402L1003FT; 条码: EBF29070054; 品牌: 合科泰; 类别: 贴片电阻0402; 规格书: 合科泰-RI系列电阻.pdf; 生命周期: 量产; PCB Footprint: R0402
R17 = RES: CLASS: DISCRETE; 规格: 贴片电阻7.5K 1% 1/16W 0402; 规格编号: 0402WGF7501TCE; 条码: EBFCIS221112140245; 品牌: 厚声; 类别: 贴片电阻0402; 规格书: 厚声-无铅厚膜电阻.pdf; 价格: 0.001521; 生命周期: 量产; PCB Footprint: R0402
R18 = RES: CLASS: DISCRETE; 规格: 贴片电阻NC 预留; 条码: EBF29070087; 类别: 贴片电阻0402; PCB Footprint: R0402
R65 R273 = RES: CLASS: DISCRETE; 生命周期: 量产; 规格书: 合科泰-RI系列电阻.pdf; 类别: 贴片电阻0402; 品牌: 合科泰; 条码: EBF29070050; 规格编号: RI0402L1001FT; 规格: 贴片电阻1K 1% 1/16W 0402; PCB Footprint: R0402
R274 = RES: CLASS: DISCRETE; 规格: 贴片电阻30K 1% 1/16W 0402; 规格编号: RI0402L3002FT; 条码: EBF29070048; 品牌: 合科泰; 类别: 贴片电阻0402; 规格书: 合科泰-RI系列电阻.pdf; 生命周期: 量产; PCB Footprint: R0402
U1 = TP6327GS6: 规格: DC-DC电源芯片 可输出电流 3A 开关工作频率 600kHz 输出类型 ADJ 输入电压范围：4V-18V; 条码: EBFCIS240710113940; 品牌: 安森德; 类别: 电源管理-DCDC; 规格书: 安森德_ASP9135ZC-R.pdf; 生命周期: 量产; 备注: RK3566金手指与BTB底板替换物料; 规格编号: ASP9135ZC-R; 可替代料: TP6327GS6; PCB Footprint: SOT23_6
U2 = MP8759GD-Z: 生命周期: 量产; 价格: 3.2; 规格书: MPS_MP8759GD-Z.pdf; 类别: 电源管理-DCDC; 品牌: MPS; 条码: EBFCIS221112174800; 规格: DC-DC电源芯片 输入：4.5V-26V 电流：8A 频率: 固定700KHz频率  FB：0.6V; 规格编号: MP8759GD-Z; PCB Footprint: QFN12-2R00X3R00
U31 U32 = TP6327GS6: 备注: RK3566金手指与BTB底板替换物料; 生命周期: 量产; 规格书: 安森德_ASP9135ZC-R.pdf; 类别: 电源管理-DCDC; 品牌: 安森德; 条码: EBFCIS240710113940; 规格: DC-DC电源芯片 可输出电流 3A 开关工作频率 600kHz 输出类型 ADJ 输入电压范围：4V-18V; 可替代料: TP6327GS6; 规格编号: ASP9135ZC-R; PCB Footprint: SOT23_6

## Sheet 3.DEBUG_SD卡_RTC_按键.SchDoc
size 297 x 209 mm; SheetNumber: 3; SheetTotal: 14
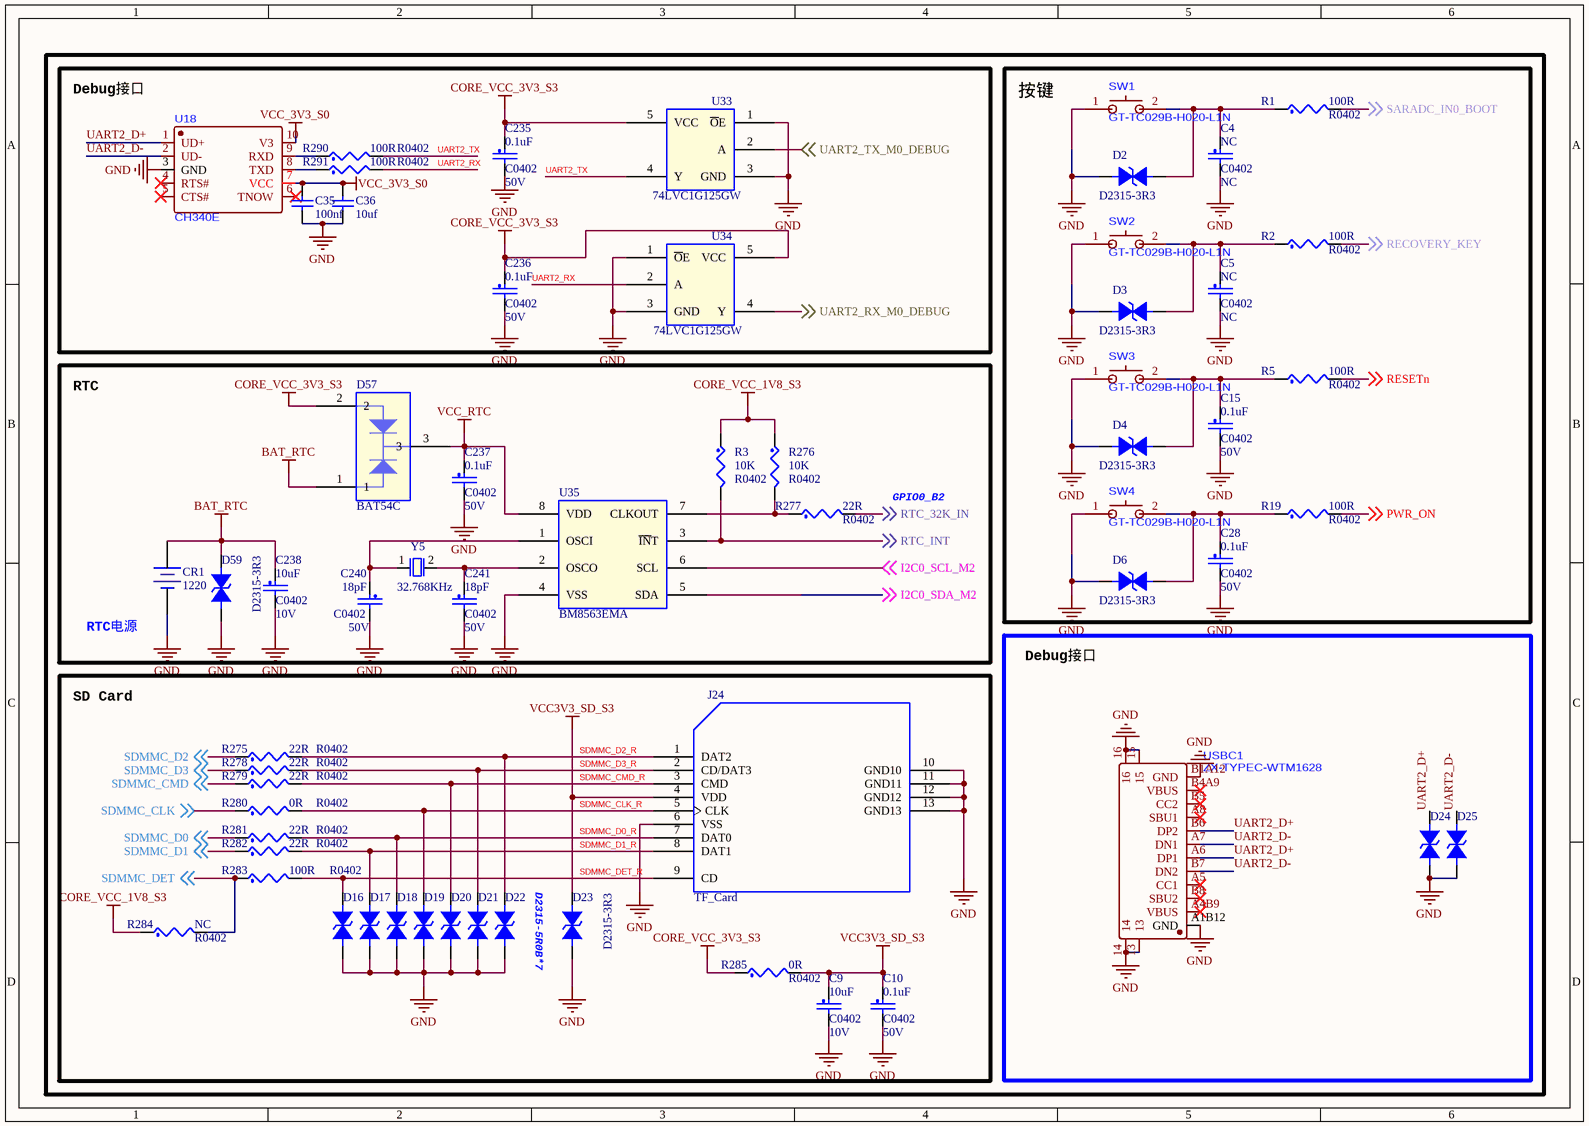
[diagram p2: 3.DEBUG_SD卡_RTC_按键.SchDoc]

### Parts
C4  NC  [C0402]
C5  NC  [C0402]
C9  10uF  Voltage: 10V  [C0402]
C10  0.1uF  Voltage: 50V  [C0402]
C15  0.1uF  Voltage: 50V  [C0402]
C28  0.1uF  Voltage: 50V  [C0402]
C35  100nf  [C0603_L]
C36  10uf  [C0603_L]
C235  0.1uF  Voltage: 50V  [C0402]
C236  0.1uF  Voltage: 50V  [C0402]
C237  0.1uF  Voltage: 50V  [C0402]
C238  10uF  Voltage: 10V  [C0402]
C240  18pF  Voltage: 50V  [C0402]
C241  18pF  Voltage: 50V  [C0402]
CR1  1220  [CR1220_A]
D2  D2315-3R3  [esd0402]
D3  D2315-3R3  [esd0402]
D4  D2315-3R3  [esd0402]
D6  D2315-3R3  [esd0402]
D16  D2315-5R0B  [esd0402]  (value not drawn)
D17  D2315-5R0B  [esd0402]  (value not drawn)
D18  D2315-5R0B  [esd0402]  (value not drawn)
D19  D2315-5R0B  [esd0402]  (value not drawn)
D20  D2315-5R0B  [esd0402]  (value not drawn)
D21  D2315-5R0B  [esd0402]  (value not drawn)
D22  D2315-5R0B  [esd0402]  (value not drawn)
D23  D2315-3R3  [esd0402]
D24  D2315-5R0B  [esd0402]  (value not drawn)
D25  D2315-5R0B  [esd0402]  (value not drawn)
D57  BAT54C  [SOT23]
D59  D2315-3R3  [esd0402]
J24  TF_Card  [TFCARD]
R1  100R  [R0402]
R2  100R  [R0402]
R3  10K  [R0402]
R5  100R  [R0402]
R19  100R  [R0402]
R275  22R  [R0402]
R276  10K  [R0402]
R277  22R  [R0402]
R278  22R  [R0402]
R279  22R  [R0402]
R280  0R  [R0402]
R281  22R  [R0402]
R282  22R  [R0402]
R283  100R  [R0402]
R284  NC  [R0402]
R285  0R  [R0402]
R290  100R  [R0402]
R291  100R  [R0402]
SW1  GT-TC029B-H020-L1N  [SW-SMD_L3.9-W2.9-P4.15-LS5.0]
SW2  GT-TC029B-H020-L1N  [SW-SMD_L3.9-W2.9-P4.15-LS5.0]
SW3  GT-TC029B-H020-L1N  [SW-SMD_L3.9-W2.9-P4.15-LS5.0]
SW4  GT-TC029B-H020-L1N  [SW-SMD_L3.9-W2.9-P4.15-LS5.0]
U18  CH340E  [MSOP-10_L3.0-W3.0-P0.50-LS5.0-BL]
U33  74LVC1G125GW  [SOT-353]
U34  74LVC1G125GW  [SOT-353]
U35  BM8563EMA  [msop-8]
USBC1  ZX-TYPEC-WTM1628  [USB-C-SMD_ZX-TYPEC-WTM1628]
Y5  32.768KHz  [3215]

### Blocks framed on the sheet
Debug接口: C35 C36 C235 C236 R290 R291 U18 U33 U34
按键: C4 C5 C15 C28 D2-D4 D6 R1 R2 R5 R19 SW1-SW4
RTC: C237 C238 C240 C241 CR1 D57 D59 R3 R276 R277 U35 Y5
Debug接口: D24 D25 USBC1
SD Card: C9 C10 D16-D23 J24 R275 R278-R285

### Nets
BAT_RTC: C238.1 CR1.1(DC+) D57.1 D59.1
CORE_VCC_1V8_S3: R3.1 R276.1 R284.1
CORE_VCC_3V3_S3: C235.1 C236.1 D57.2 R285.1 U33.5(VCC) U34.5(VCC)
GND: C4.2 C5.2 C9.2 C10.2 C15.2 C28.2 C35.1 C36.1 C235.2 C236.2 C237.2 C238.2 C240.2 C241.2 CR1.2(DC-) D2.1 D3.1 D4.1 D6.1 D16.1 D17.1 D18.1 D19.1 D20.1 D21.1 D22.1 D23.2 D24.1 D25.1 D59.2 J24.6(VSS) J24.10(GND10) J24.11(GND11) J24.12(GND12) J24.13(GND13) SW1.1 SW2.1 SW3.1 SW4.1 U18.3(GND) U33.1(~{O}E) U33.3(GND) U34.1(~{O}E) U34.3(GND) U35.4(VSS) USBC1.13 USBC1.14 USBC1.15 USBC1.16 USBC1.A1B12(GND) USBC1.B1A12(GND)
VCC3V3_SD_S3: C9.1 C10.1 D23.1 J24.4(VDD) R285.2
VCC_3V3_S0: C35.2 C36.2 U18.7(VCC) U18.10(V3)
VCC_RTC: C237.1 D57.3 U35.8(VDD)
I2C0_SCL_M2: U35.6(SCL) ; off-sheet I2C0_SCL_M2
I2C0_SDA_M2: U35.5(SDA) ; off-sheet I2C0_SDA_M2
PWR_ON: R19.2 ; off-sheet PWR_ON
RECOVERY_KEY: R2.2 ; off-sheet RECOVERY_KEY
RESETn: R5.2 ; off-sheet RESETn
RTC_32K_IN: R277.2 ; off-sheet RTC_32K_IN  [project net GPIO0_B2]
RTC_INT: R3.2 U35.3(~{IN}T) ; off-sheet RTC_INT
SARADC_IN0_BOOT: R1.2 ; off-sheet SARADC_IN0_BOOT
SDMMC_CLK: R280.1 ; off-sheet SDMMC_CLK
SDMMC_CLK_R: D19.2 J24.5(CLK) R280.2
SDMMC_CMD: R279.1 ; off-sheet SDMMC_CMD
SDMMC_CMD_R: D20.2 J24.3(CMD) R279.2
SDMMC_D0: R281.1 ; off-sheet SDMMC_D0
SDMMC_D0_R: D18.2 J24.7(DAT0) R281.2
SDMMC_D1: R282.1 ; off-sheet SDMMC_D1
SDMMC_D1_R: D17.2 J24.8(DAT1) R282.2
SDMMC_D2: R275.1 ; off-sheet SDMMC_D2
SDMMC_D2_R: D22.2 J24.1(DAT2) R275.2
SDMMC_D3: R278.1 ; off-sheet SDMMC_D3
SDMMC_D3_R: D21.2 J24.2(CD/DAT3) R278.2
SDMMC_DET: R283.1 R284.2 ; off-sheet SDMMC_DET
SDMMC_DET_R: D16.2 J24.9(CD) R283.2
UART2_D+: D24.2 U18.1(UD+) USBC1.A6(DP1) USBC1.B6(DP2)
UART2_D-: D25.2 U18.2(UD-) USBC1.A7(DN1) USBC1.B7(DN2)
UART2_RX: R291.2 U34.2(A)
UART2_RX_M0_DEBUG: U34.4(Y) ; off-sheet UART2_RX_M0_DEBUG
UART2_TX: R290.2 U33.4(Y)
UART2_TX_M0_DEBUG: U33.2(A) ; off-sheet UART2_TX_M0_DEBUG
NetC4_1: C4.1 D2.2 R1.1 SW1.2
NetC5_1: C5.1 D3.2 R2.1 SW2.2
NetC15_1: C15.1 D4.2 R5.1 SW3.2
NetC28_1: C28.1 D6.2 R19.1 SW4.2
NetC240_1: C240.1 U35.1(OSCI) Y5.1
NetC241_1: C241.1 U35.2(OSCO) Y5.2
NetR276_2: R276.2 R277.1 U35.7(CLKOUT)
NetR290_1: R290.1 U18.9(RXD)
NetR291_1: R291.1 U18.8(TXD)

Not connected (* = marked no-connect by the designer): U18 4(RTS#)* 5(CTS#)* 6(TNOW)*; USBC1 A4B9(VBUS)* A5(CC1)* A8(SBU1)* B4A9(VBUS)* B5(CC2)* B8(SBU2)*

### Notes on the sheet
- (near R277) GPIO0_B2
- RTC电源
- D2315-5R0B*7

### Library data of the parts
C4 = CAP_NP: CLASS: DISCRETE; 类别: 贴片电容0402; 条码: EBF29060149; 规格: 贴片电容NC 预留; Voltage: NC; PCB Footprint: C0402
C5 = CAP_NP: as C7 on sheet 2.电源; Voltage: NC; PCB Footprint: C0402
C9 C238 = CAP_NP: CLASS: DISCRETE; 生命周期: 量产; 价格: 0.518415; 规格书: 三星电容.pdf; 类别: 贴片电容0402; 品牌: 三星; 条码: EBF29060247; 规格编号: CL05A106MP8NUB8; 规格: 贴片电容10uF 20% 10V X5R 0402; PCB Footprint: C0402
C10 C15 C28 C236 = CAP_NP: as C6 on sheet 2.电源; PCB Footprint: C0402
C35 C36 = C: 贴片电容/MLCC电容; BOM名称: 无极性贴片电容; 联系下单店铺卖家 免费帮你查找封装: 联系下单店铺卖家 免费技术支持
C235 C237 = CAP_NP: as C3 on sheet 2.电源; PCB Footprint: C0402
C240 C241 = CAP_NP: CLASS: DISCRETE; 规格: 贴片电容18pF 5% 50V C0G 0402; 规格编号: 0402CG180J500NT; 条码: EBF29060235; 品牌: 风华; 类别: 贴片电容0402; 规格书: 风华电容.pdf; 价格: 0.00515; 生命周期: 量产; PCB Footprint: C0402
CR1 = BAT_CR1220_CR2032: 微型电池; 联系下单店铺卖家 免费技术支持: 联系下单店铺卖家 免费帮你查找封装; BOM名称: 微型电池
D2-D4 D6 D23 D59 = DIODE BI-DIR TRIG: 生命周期: 量产; 规格书: 千虹_D2315-3R3.pdf; 类别: 贴片ESD; 品牌: 千虹; 条码: EBFCIS240517170749; 规格: 防静电保护ESD二极管 反向工作电压3.3V 击穿电压3.5V 钳位电压9V 结电容Cj 10pF; 备注: 通用; PCB Footprint: esd0402; 规格编号: D2315-3R3
D16-D22 D24 D25 = DIODE BI-DIR TRIG: 备注: 通用; 生命周期: 量产; 规格书: 千虹_D2315-5R0B.pdf; 类别: 贴片ESD; 品牌: 千虹; 条码: EBFCIS240517170922; 规格: 防静电保护ESD二极管 反向工作电压5V 击穿电压7V 钳位电压10.5V 结电容Cj 0.3pF; PCB Footprint: esd0402; 规格编号: D2315-5R0B
D57 = BAT54C: 规格: 肖特基双二极管 直流反向耐压(Vr) 30V 平均整流电流(Io) 300mA 正向压降(Vf) 1V@100mA; 条码: EBF29140062; 品牌: 江苏长电; 类别: 贴片肖特基二极管; 规格书: 江苏长电_BAT54C.pdf; 价格: 0.077486; 生命周期: 量产; 丝印: KL3; PCB Footprint: SOT23; 规格编号: BAT54C
J24 = TF_Card: CLASS: IO; 可替代料: EBF29040003; 生命周期: 量产; 价格: 0.48; 规格书: 硕方-TF-015.pdf; 类别: SD卡连接器; 品牌: 硕方; 规格编号: TF-015; 规格: MICRO SD 卡座 TF T-Flash 外焊 双压片 自弹贴片; PCB Footprint: TFCARD; 条码: EBF29040003
R1 = RES: CLASS: DISCRETE; 生命周期: 量产; 规格书: 合科泰-RI系列电阻.pdf; 类别: 贴片电阻0402; 品牌: 合科泰; 条码: EBF29070053; 规格编号: RI0402L1000FT; 规格: 贴片电阻100R 1% 1/16W 0402; PCB Footprint: R0402
R2 R5 R19 R283 R290 R291 = RES: CLASS: DISCRETE; 规格: 贴片电阻100R 1% 1/16W 0402; 规格编号: RI0402L1000FT; 条码: EBF29070053; 品牌: 合科泰; 类别: 贴片电阻0402; 规格书: 合科泰-RI系列电阻.pdf; 生命周期: 量产; PCB Footprint: R0402
R3 R276 = RES: CLASS: DISCRETE; 生命周期: 量产; 价格: 0.002773; 规格书: 厚声-无铅厚膜电阻.pdf; 类别: 贴片电阻0402; 品牌: 厚声; 条码: EBF29070046; 规格编号: 0402WGF1002TCE; 规格: 贴片电阻10K 1% 1/16W 0402; PCB Footprint: R0402
R275 R277-R279 R281 R282 = RES: CLASS: DISCRETE; 规格: 贴片电阻22R 1% 1/16W 0402; 规格编号: RI0402L22R0FT; 条码: EBF29070181; 品牌: 合科泰; 类别: 贴片电阻0402; 规格书: 合科泰-RI系列电阻.pdf; 生命周期: 量产; PCB Footprint: R0402
R280 = RES: CLASS: DISCRETE; 规格: 贴片电阻0R 1% 1/16W 0402; 规格编号: RI0402L000FT; 条码: EBF29070049; 品牌: 合科泰; 类别: 贴片电阻0402; 规格书: 合科泰-RI系列电阻.pdf; 生命周期: 量产; PCB Footprint: R0402
R284 = RES: as R25 on sheet 1.BTB; PCB Footprint: R0402
R285 = RES: CLASS: DISCRETE; 生命周期: 量产; 规格书: 合科泰-RI系列电阻.pdf; 类别: 贴片电阻0402; 品牌: 合科泰; 条码: EBF29070049; 规格编号: RI0402L000FT; 规格: 贴片电阻0R 1% 1/16W 0402; PCB Footprint: R0402
U33 U34 = 74LVC1G125: 丝印: VM; 生命周期: 量产; 价格: 0.182409; 规格书: 74LVC1G125GW.pdf; 类别: 隔离器件; 品牌: 安世; 条码: EBF29170001; 规格: 时钟缓冲器 驱动器 具有三态输出 允许工作电压为3.3V 5.5V 典型工作电流100mA; PCB Footprint: SOT-353; 规格编号: 74LVC1G125GW
U35 = HYM8563S: 生命周期: 量产; 价格: 0.8789; 规格书: 捷茂微_BM8563EMA.pdf; 类别: 实时时钟芯片; 品牌: 捷茂微; 条码: EBFCIS240229100017; 规格: 工作电压1.5V~5.5V 日期格式YY-MM-DD 时间格式HH:MM:SS 接口类型I2C 电流消耗0.25uA~@3.0V; 备注: 鲁班猫系列板子; 规格编号: BM8563EMA; PCB Footprint: msop-8
Y5 = CRYSTAL_2P: 生命周期: 量产; 价格: 2.57; 规格书: 爱普生-32.768KHz.pdf; 类别: 贴片晶振 3215; 品牌: 爱普生; 条码: EBF29100004; 规格编号: Q13FC1350000300; 规格: 无源晶振32.768KHz 70KΩ 9pF 3215; PCB Footprint: 3215

## Sheet 4.以太网_eth1.SchDoc
size 297 x 209 mm; SheetNumber: 4; SheetTotal: 14
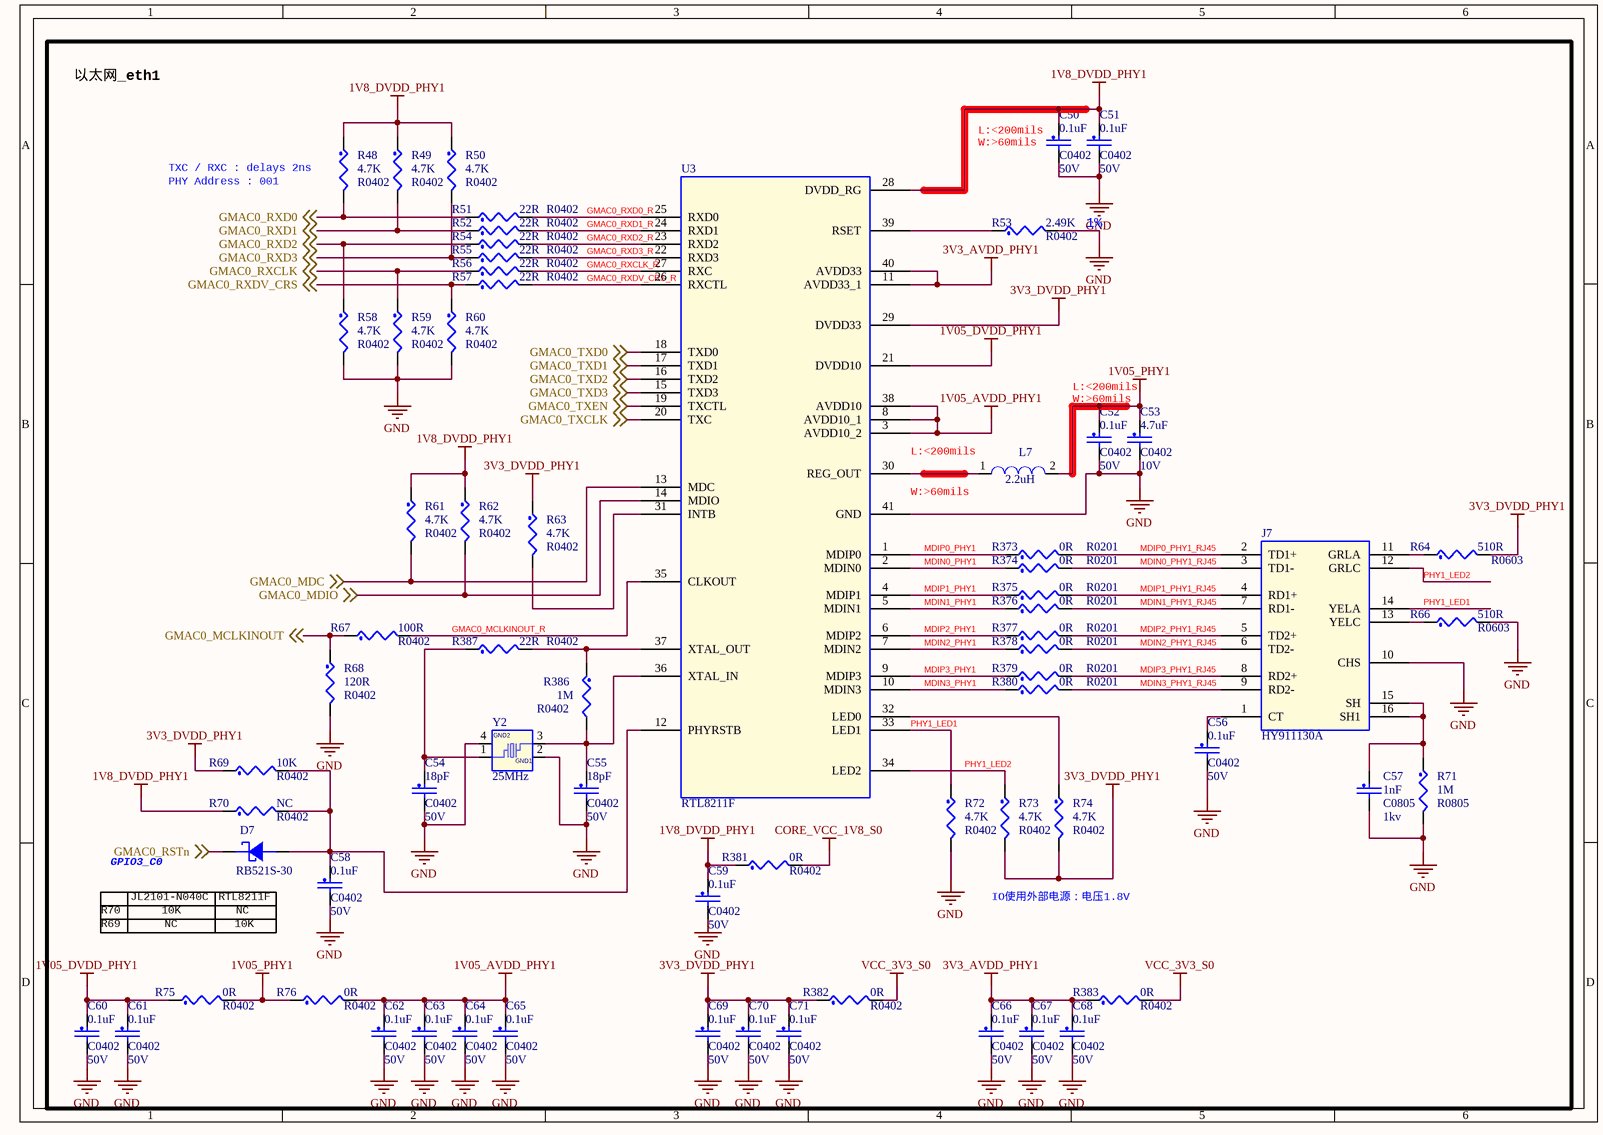
[diagram p3: 4.以太网_eth1.SchDoc]

### Parts
C50  0.1uF  Voltage: 50V  [C0402]
C51  0.1uF  Voltage: 50V  [C0402]
C52  0.1uF  Voltage: 50V  [C0402]
C53  4.7uF  Voltage: 10V  [C0402]
C54  18pF  Voltage: 50V  [C0402]
C55  18pF  Voltage: 50V  [C0402]
C56  0.1uF  Voltage: 50V  [C0402]
C57  1nF  Voltage: 1kv  [C0805]
C58  0.1uF  Voltage: 50V  [C0402]
C59  0.1uF  Voltage: 50V  [C0402]
C60  0.1uF  Voltage: 50V  [C0402]
C61  0.1uF  Voltage: 50V  [C0402]
C62  0.1uF  Voltage: 50V  [C0402]
C63  0.1uF  Voltage: 50V  [C0402]
C64  0.1uF  Voltage: 50V  [C0402]
C65  0.1uF  Voltage: 50V  [C0402]
C66  0.1uF  Voltage: 50V  [C0402]
C67  0.1uF  Voltage: 50V  [C0402]
C68  0.1uF  Voltage: 50V  [C0402]
C69  0.1uF  Voltage: 50V  [C0402]
C70  0.1uF  Voltage: 50V  [C0402]
C71  0.1uF  Voltage: 50V  [C0402]
D7  RB521S-30  [SOD523]
J7  HY911130A  [HY911130A]
L7  2.2uH  [L2520]
R48  4.7K  [R0402]
R49  4.7K  [R0402]
R50  4.7K  [R0402]
R51  22R  [R0402]
R52  22R  [R0402]
R53  2.49K  [R0402]
R54  22R  [R0402]
R55  22R  [R0402]
R56  22R  [R0402]
R57  22R  [R0402]
R58  4.7K  [R0402]
R59  4.7K  [R0402]
R60  4.7K  [R0402]
R61  4.7K  [R0402]
R62  4.7K  [R0402]
R63  4.7K  [R0402]
R64  510R  [R0603]
R66  510R  [R0603]
R67  100R  [R0402]
R68  120R  [R0402]
R69  10K  [R0402]
R70  NC  [R0402]
R71  1M  [R0805]
R72  4.7K  [R0402]
R73  4.7K  [R0402]
R74  4.7K  [R0402]
R75  0R  [R0402]
R76  0R  [R0402]
R373  0R  [R0201]
R374  0R  [R0201]
R375  0R  [R0201]
R376  0R  [R0201]
R377  0R  [R0201]
R378  0R  [R0201]
R379  0R  [R0201]
R380  0R  [R0201]
R381  0R  [R0402]
R382  0R  [R0402]
R383  0R  [R0402]
R386  1M  [R0402]
R387  22R  [R0402]
U3  RTL8211F  [qfp_40p_r]
Y2  25MHz  [3225]

### Nets
1V05_AVDD_PHY1: C62.1 C63.1 C64.1 C65.1 R76.2 U3.3(AVDD10_2) U3.8(AVDD10_1) U3.38(AVDD10)
1V05_DVDD_PHY1: C60.1 C61.1 R75.1 U3.21(DVDD10)
1V05_PHY1: C52.1 C53.1 L7.2 R75.2 R76.1
1V8_DVDD_PHY1: C50.1 C51.1 C59.1 R48.1 R49.1 R50.1 R61.1 R62.1 R70.1 R381.1 U3.28(DVDD_RG)
3V3_AVDD_PHY1: C66.1 C67.1 C68.1 R383.1 U3.11(AVDD33_1) U3.40(AVDD33)
3V3_DVDD_PHY1: C69.1 C70.1 C71.1 R63.1 R64.2 R69.1 R73.2 R74.2 R382.1 U3.29(DVDD33)
CORE_VCC_1V8_S0: R381.2
GND: C50.2 C51.2 C52.2 C53.2 C54.2 C55.2 C56.2 C57.2 C58.2 C59.2 C60.2 C61.2 C62.2 C63.2 C64.2 C65.2 C66.2 C67.2 C68.2 C69.2 C70.2 C71.2 J7.10(CHS) R53.2 R58.2 R59.2 R60.2 R66.2 R68.2 R71.2 R72.2 U3.41(GND) Y2.2(GND1) Y2.4(GND2)
VCC_3V3_S0: R382.2 R383.2
GMAC0_MCLKINOUT: R67.1 R68.1 ; off-sheet GMAC0_MCLKINOUT
GMAC0_MCLKINOUT_R: R67.2 U3.35(CLKOUT)
GMAC0_MDC: R61.2 U3.13(MDC) ; off-sheet GMAC0_MDC
GMAC0_MDIO: R62.2 U3.14(MDIO) ; off-sheet GMAC0_MDIO
GMAC0_RSTn: D7.1 ; off-sheet GMAC0_RSTn
GMAC0_RXCLK: R56.1 R59.1 ; off-sheet GMAC0_RXCLK
GMAC0_RXCLK_R: R56.2 U3.27(RXC)
GMAC0_RXD0: R48.2 R51.1 ; off-sheet GMAC0_RXD0
GMAC0_RXD0_R: R51.2 U3.25(RXD0)
GMAC0_RXD1: R49.2 R52.1 ; off-sheet GMAC0_RXD1
GMAC0_RXD1_R: R52.2 U3.24(RXD1)
GMAC0_RXD2: R54.1 R58.1 ; off-sheet GMAC0_RXD2
GMAC0_RXD2_R: R54.2 U3.23(RXD2)
GMAC0_RXD3: R50.2 R55.1 ; off-sheet GMAC0_RXD3
GMAC0_RXD3_R: R55.2 U3.22(RXD3)
GMAC0_RXDV_CRS: R57.1 R60.1 ; off-sheet GMAC0_RXDV_CRS
GMAC0_RXDV_CRS_R: R57.2 U3.26(RXCTL)
GMAC0_TXCLK: U3.20(TXC) ; off-sheet GMAC0_TXCLK
GMAC0_TXD0: U3.18(TXD0) ; off-sheet GMAC0_TXD0
GMAC0_TXD1: U3.17(TXD1) ; off-sheet GMAC0_TXD1
GMAC0_TXD2: U3.16(TXD2) ; off-sheet GMAC0_TXD2
GMAC0_TXD3: U3.15(TXD3) ; off-sheet GMAC0_TXD3
GMAC0_TXEN: U3.19(TXCTL) ; off-sheet GMAC0_TXEN
MDIN0_PHY1: R374.1 U3.2(MDIN0)
MDIN0_PHY1_RJ45: J7.3(TD1-) R374.2
MDIN1_PHY1: R376.1 U3.5(MDIN1)
MDIN1_PHY1_RJ45: J7.7(RD1-) R376.2
MDIN2_PHY1: R378.1 U3.7(MDIN2)
MDIN2_PHY1_RJ45: J7.6(TD2-) R378.2
MDIN3_PHY1: R380.1 U3.10(MDIN3)
MDIN3_PHY1_RJ45: J7.9(RD2-) R380.2
MDIP0_PHY1: R373.1 U3.1(MDIP0)
MDIP0_PHY1_RJ45: J7.2(TD1+) R373.2
MDIP1_PHY1: R375.1 U3.4(MDIP1)
MDIP1_PHY1_RJ45: J7.4(RD1+) R375.2
MDIP2_PHY1: R377.1 U3.6(MDIP2)
MDIP2_PHY1_RJ45: J7.5(TD2+) R377.2
MDIP3_PHY1: R379.1 U3.9(MDIP3)
MDIP3_PHY1_RJ45: J7.8(RD2+) R379.2
PHY1_LED1: J7.14(YELA) R72.1 U3.33(LED1)
PHY1_LED2: J7.12(GRLC) R73.1 U3.34(LED2)
NetC54_1: C54.1 R387.1 Y2.1
NetC55_1: C55.1 R386.2 U3.36(XTAL_IN) Y2.3
NetC56_1: C56.1 J7.1(CT)
NetC57_1: C57.1 J7.15(SH) J7.16(SH1) R71.1
NetC58_1: C58.1 D7.2 R69.2 R70.2 U3.12(PHYRSTB)
NetJ7_11: J7.11(GRLA) R64.1
NetJ7_13: J7.13(YELC) R66.1
NetL7_1: L7.1 U3.30(REG_OUT)
NetR53_1: R53.1 U3.39(RSET)
NetR63_2: R63.2 U3.31(INTB)
NetR74_1: R74.1 U3.32(LED0)
NetR386_1: R386.1 R387.2 U3.37(XTAL_OUT)

### Notes on the sheet
- 以太网_eth1
- PHY Address : 001
- TXC / RXC : delays 2ns
- (near C50) L:<200mils
  W:>60mils
- (near R53) 1%
- L:<200mils
  W:>60mils
- L:<200mils
- W:>60mils
- GPIO3_C0
- R70
- R69
- JL2101-N040C
- 10K
- NC
- (near D7) RTL8211F
- IO使用外部电源：电压1.8V

### Library data of the parts
C50-C52 C59 C66-C68 = CAP_NP: as C3 on sheet 2.电源; PCB Footprint: C0402
C53 = CAP_NP: CLASS: DISCRETE; 规格: 贴片电容4.7uF 10% 10V X5R 0402; 规格编号: CC0402KRX5R6BB475; 条码: EBF29060248; 品牌: 国巨; 类别: 贴片电容0402; 规格书: 国巨-贴片电容.pdf; 价格: 0.059058; 生命周期: 量产; PCB Footprint: C0402
C54 C55 = CAP_NP: as C240 on sheet 3.DEBUG_SD卡_RTC_按键; PCB Footprint: C0402
C56 C58 C60-C65 C69-C71 = CAP_NP: as C6 on sheet 2.电源; PCB Footprint: C0402
C57 = CAP_NP: CLASS: DISCRETE; 生命周期: 量产; 价格: 0.083527; 规格书: 华新科0805系列高压贴片电容.pdf; 类别: 贴片电容0805; 品牌: 华新科; 条码: EBF29060304; 规格编号: 0805B102K102CT; 规格: 贴片电容1nF 10% 1kV X7R 0805; PCB Footprint: C0805
D7 = DIODE_SCHTKY: CLASS: IC; 生命周期: 量产; 价格: 0.06781; 规格书: 江苏长电_RB521S-30.pdf; 类别: 贴片肖特基二极管; 品牌: 江苏长电; 条码: EBFCIS221114153437; 规格: 直流反向耐压(Vr)：30V 平均整流电流(Io)：200mA 正向压降(Vf)：500mV@200mA 30V@100mA,VF=350mV@10mA; PCB Footprint: SOD523; 规格编号: RB521S-30
J7 = HY911130A: 规格: 屏蔽式以太网连接器RJ45 引脚数14 LED灯黄绿 1000M; 条码: EBF29040053; 品牌: 汉仁; 类别: 网口; 规格书: 汉仁_1000M_ HY911130A.pdf; 价格: 11.12; 生命周期: 量产; PCB Footprint: HY911130A; 规格编号: HY911130A; 可替代料: EBF29040053
L7 = IND: CLASS: DISCRETE; 规格: 功率电感2.2uH 2.2uH ±20% 2.06A 85mΩ; 规格编号: WIP252012P-2R2ML; 条码: EBFCIS220927171910; 品牌: 佳邦; 类别: 贴片电感2520; 规格书: 佳邦_ WIP252012P-2R2ML.pdf; 价格: 0.129914; 生命周期: 量产; PCB Footprint: L2520
R48-R50 R58-R63 R72-R74 = RES: as R11 on sheet 2.电源; PCB Footprint: R0402
R51 R52 R54-R57 = RES: CLASS: DISCRETE; 生命周期: 量产; 规格书: 合科泰-RI系列电阻.pdf; 类别: 贴片电阻0402; 品牌: 合科泰; 条码: EBF29070181; 规格编号: RI0402L22R0FT; 规格: 贴片电阻22R 1% 1/16W 0402; PCB Footprint: R0402
R53 = RES: CLASS: DISCRETE; 价格: 0.004709; 生命周期: 量产; 规格书: 厚声-无铅厚膜电阻.pdf; 类别: 贴片电阻0402; 品牌: 厚声; 条码: EBF29070292; 规格编号: 0402WGF2491TCE; 规格: 贴片电阻2.49K 1% 1/16W 0402; PCB Footprint: R0402
R64 = RES: CLASS: DISCRETE; 规格: 贴片电阻510R 1% 1/10W 0603; 规格编号: RI0603L5100FT; 条码: EBF29070091; 品牌: 合科泰; 类别: 贴片电阻0603; 规格书: 合科泰-RI系列电阻.pdf; 生命周期: 量产; PCB Footprint: R0603
R66 = RES: CLASS: DISCRETE; 生命周期: 量产; 规格书: 合科泰-RI系列电阻.pdf; 类别: 贴片电阻0603; 品牌: 合科泰; 条码: EBF29070091; 规格编号: RI0603L5100FT; 规格: 贴片电阻510R 1% 1/10W 0603; PCB Footprint: R0603
R67 = RES: as R1 on sheet 3.DEBUG_SD卡_RTC_按键; PCB Footprint: R0402
R68 = RES: CLASS: DISCRETE; 生命周期: 量产; 规格书: 厚声-无铅厚膜电阻.pdf; 类别: 贴片电阻0402; 品牌: 厚声; 条码: EBF29070275; 规格编号: 0402WGF1200TCE; 规格: 贴片电阻120R 1% 1/16W 0402; 价格: 0.002198; PCB Footprint: R0402
R69 = RES: as R3 on sheet 3.DEBUG_SD卡_RTC_按键; PCB Footprint: R0402
R70 = RES: as R18 on sheet 2.电源; PCB Footprint: R0402
R71 = RES: CLASS: DISCRETE; 生命周期: 量产; 价格: 0.02396; 规格书: YAGEO国巨厚膜无铅电阻.pdf; 类别: 贴片电阻0805; 品牌: 国巨; 条码: EBF29070294; 规格编号: AC0805FR-071ML; 规格: 贴片电阻1M 1% 1/8W 0805; PCB Footprint: R0805
R75 R76 R381 R382 = RES: as R285 on sheet 3.DEBUG_SD卡_RTC_按键; PCB Footprint: R0402
R373-R380 = RES: CLASS: DISCRETE; 规格: 贴片电阻0R 1% 1/20W 0201; 规格编号: RI0201L0000FT; 条码: EBF29070164; 品牌: 合科泰; 类别: 贴片电阻0201; 规格书: 合科泰-RI系列电阻.pdf; 生命周期: 量产; PCB Footprint: R0201
R383 = RES: as R280 on sheet 3.DEBUG_SD卡_RTC_按键; PCB Footprint: R0402
R386 = RES: CLASS: DISCRETE; 生命周期: 量产; 规格书: 合科泰-RI系列电阻.pdf; 类别: 贴片电阻0402; 品牌: 厚声; 条码: EBF29070062; 规格编号: RI0402L1004FT; 规格: 贴片电阻1M 1% 1/16W 0402; PCB Footprint: R0402
R387 = RES: as R275 on sheet 3.DEBUG_SD卡_RTC_按键; PCB Footprint: R0402
U3 = RTL8211F: 价格: 15.2; 生命周期: 量产; 规格书: 瑞昱_RTL8211F-CG.pdf; 类别: 以太网芯片; 品牌: 瑞昱; 条码: EBF29150018; 规格编号: RTL8211F-CG; 规格: 以太网芯片 10M/100M/1000M 控制接口：RGMII RGMII电压：3.3V/2.5V/1.8V/1.5V; PCB Footprint: qfp_40p_r
Y2 = CRYSTAL_4P: CLASS: IC; 规格: 无源晶振25MHZ 50Ω 16pF 3225; 规格编号: X322525MQB4SI; 条码: EBF29100005; 品牌: 扬兴科技; 类别: 贴片晶振 3225; 规格书: 扬兴科技-25MHZ.pdf; 价格: 0.385846; 生命周期: 量产; PCB Footprint: 3225